# EasyEDA Pro project li-chuang-kai-fa-ban-pid-jian-yi-ru-men-tao-jian-c5ce5a79.epro

# Schematic Schematic1
Board Name: V1.0.0; Create Date: 2025-01-16; Page Name: P1; Project Name: PID简易入门套件; Schematic Name: Schematic1; Update Date: 2025-02-06; Company: 嘉立创EDA; Page Size: A4; Reviewed: 嘉立创EDA
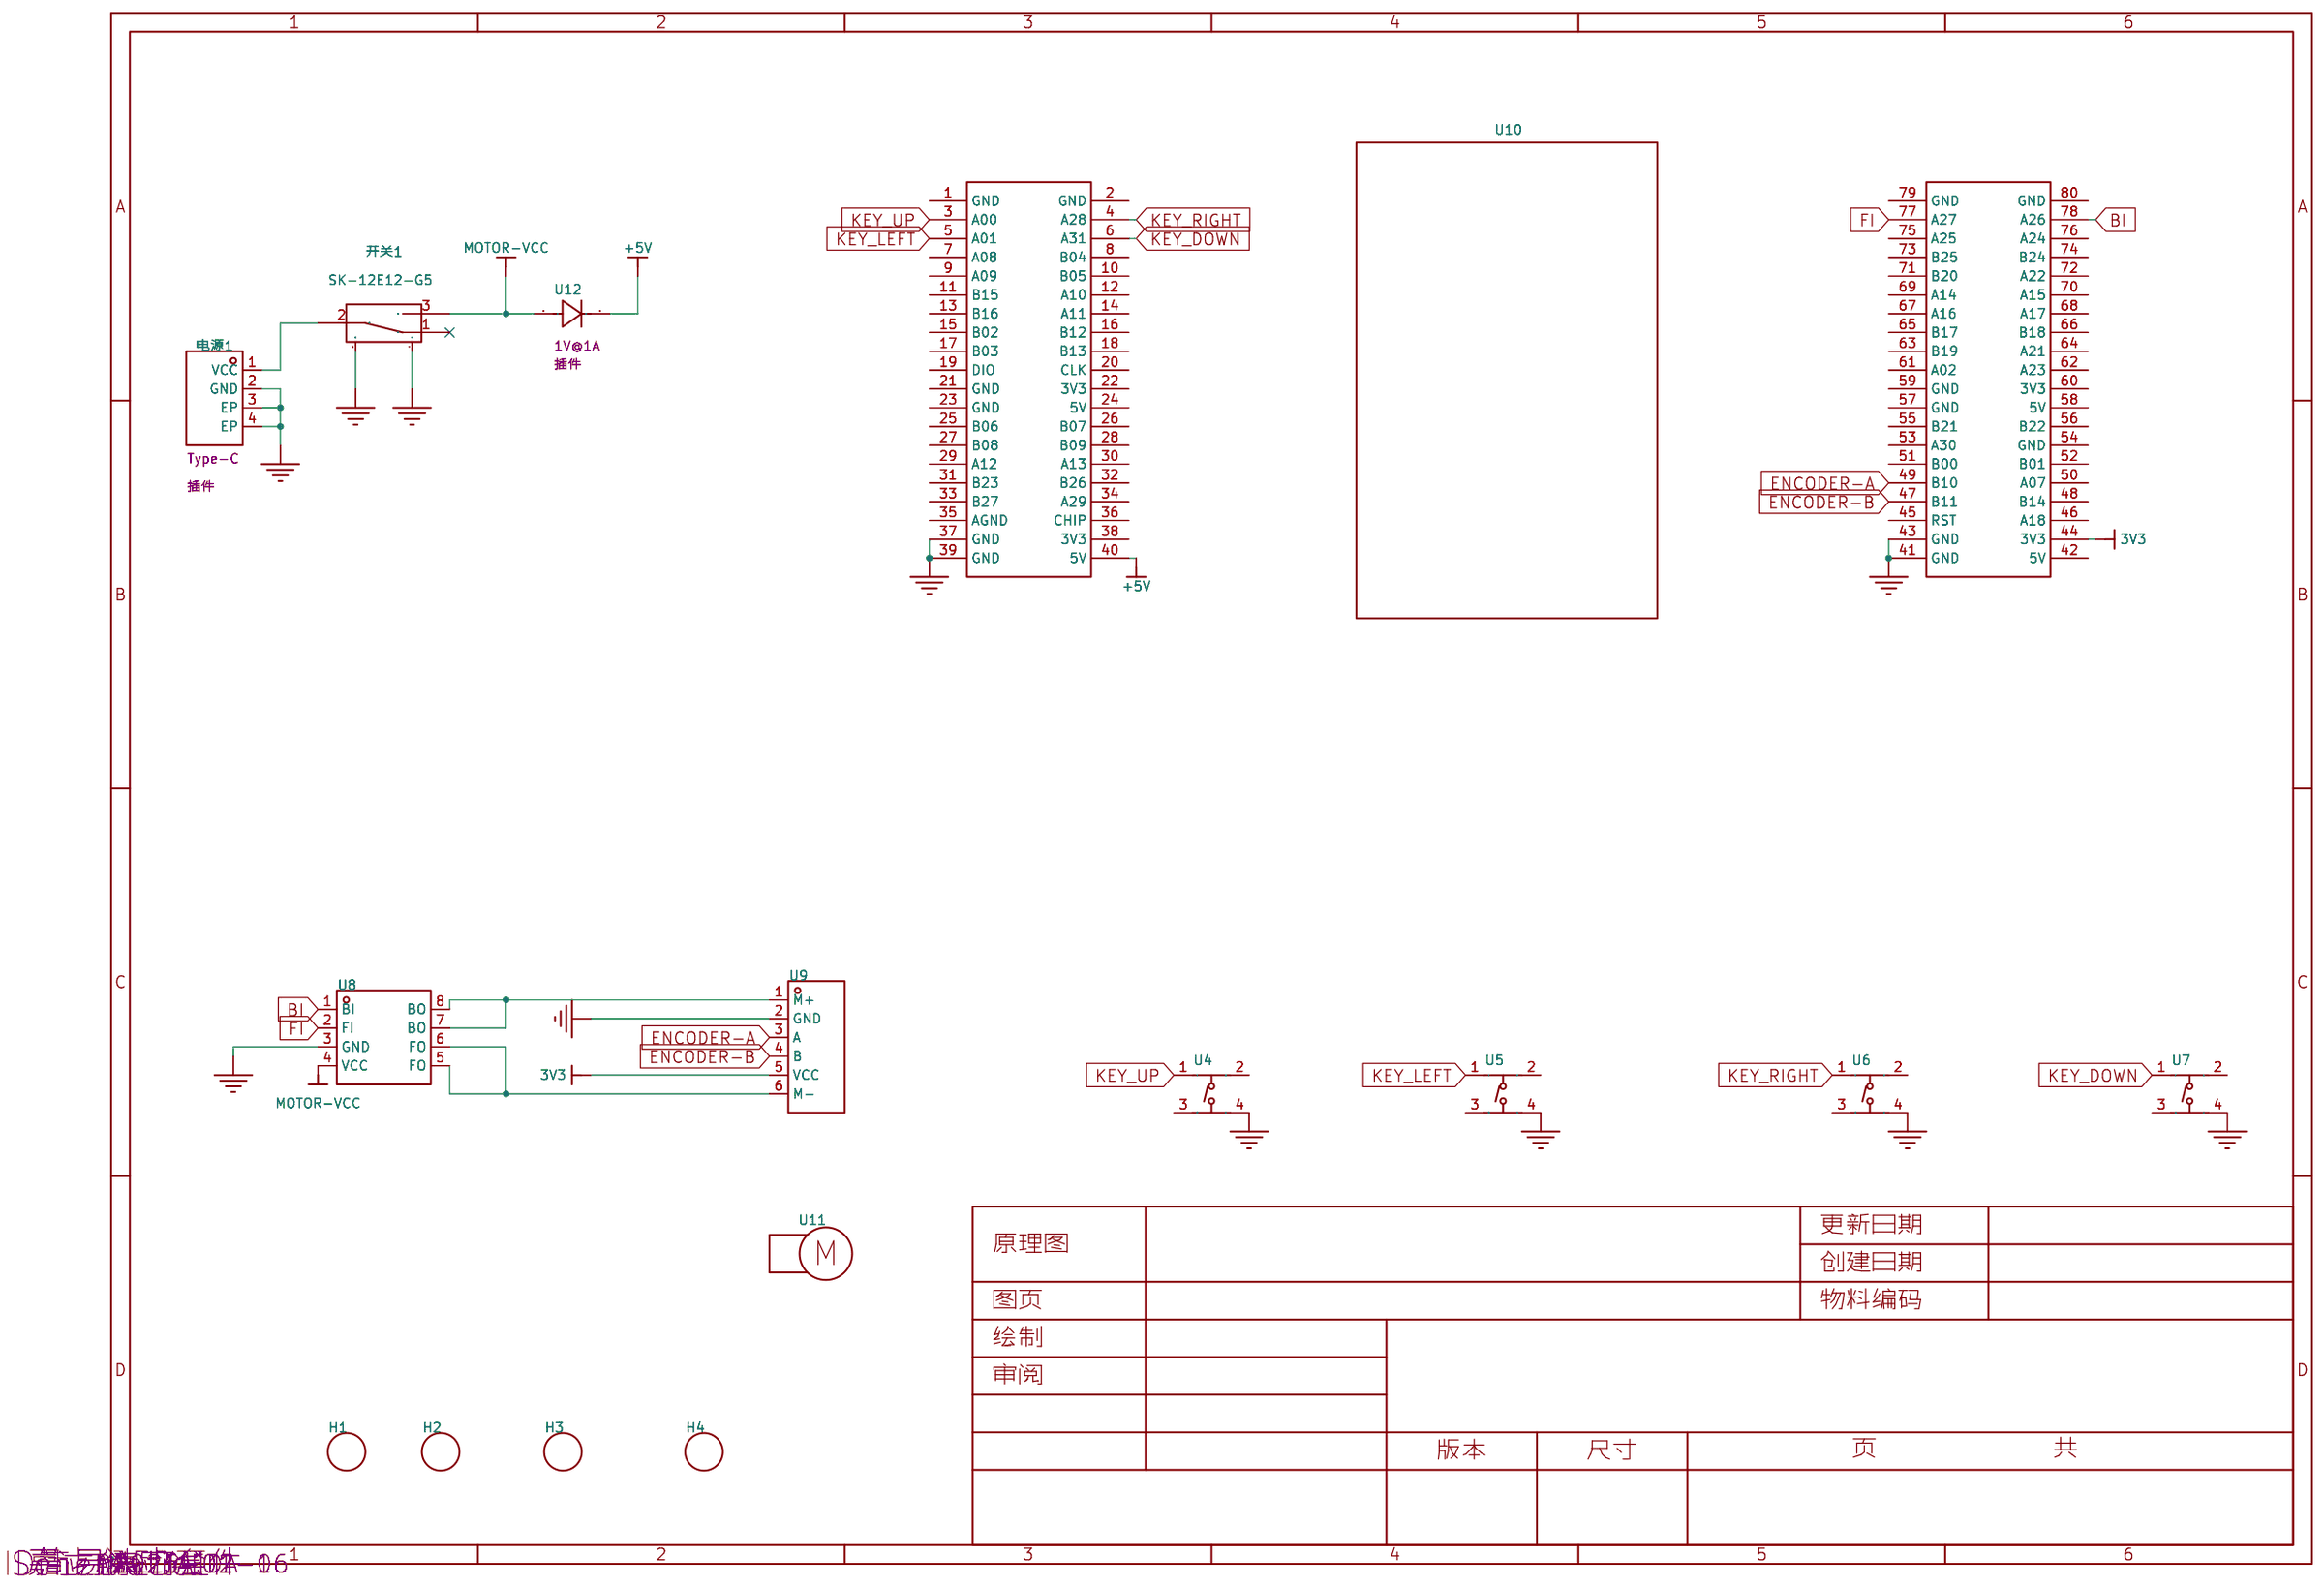
[diagram p0: schematic sheet]

## Parts
H1  M3  [m3 125x300]
H2  M3  [m3 125x300]
H3  M3  [m3 125x300]
H4  M3  [m3 125x300]
U4  ZX-QC66-8.5CJ  [SW-TH_4P-L6.0-W6.0-P4.50-LS6.3]
U5  ZX-QC66-8.5CJ  [SW-TH_4P-L6.0-W6.0-P4.50-LS6.3]
U6  ZX-QC66-8.5CJ  [SW-TH_4P-L6.0-W6.0-P4.50-LS6.3]
U7  ZX-QC66-8.5CJ  [SW-TH_4P-L6.0-W6.0-P4.50-LS6.3]
U8  BDR6126D  [DIP-8_L9.3-W6.4-P2.54-LS7.6-BL-1]
U9  2.54mm-6P ZZ  [CONN-TH_6P-P2.50_HCTL_XH-6A_C2908604]
U10  LCKFB-TMX-MSPM0G3507  [COMM-TH_LCKFB-TMX-MSPM0G3507]
U11  -  [TT马达]
U12  D7G-T  [DIO-TH_BD2.4-L3.2-P7.20-D0.8-RD]
开关1  SK-12E12-G5  [SW-TH_SK-12E12-G5]
电源1  KH-TYPE-C-2P  [USB-SMD_KH-TYPE-C-2P]

## Library data of the parts
H1-H4 = M3
U4-U7 = ZX-QC66-8.5CJ: 电路结构:单刀单掷;按钮形状:圆形按钮;作用力:2.6N;安装方式:直插;开关长度:6mm;开关宽度:6mm;开关高度:8.5mm;带支架:不带;触点电流:50mA;额定电压(AC):250V;额定电压(DC):12V;绝缘电阻:100MΩ;机械寿命:10万次;; LCSC Part Name: 6*6*8.5插件; Supplier Part: C7470133; Manufacturer: Megastar(兆星); Supplier Footprint: 插件; JLCPCB Part Class: 扩展库; Datasheet: https://atta.szlcsc.com/upload/public/pdf/source/20230724/D2816B8FE4BFA624BB09D744C6224BA3.pdf; Supplier: LCSC; Circuit: 单刀单掷; Actuator Style: 圆形按钮; Operating Force: 2.6N; Mounting Style: 直插; Switch Length: 6mm; Switch Width: 6mm; Switch Height: 8.5mm; Strike Gundam: 不带; Contact Current: 50mA; Voltage Rating (AC): 250V; Voltage Rating (DC): 12V; Insulation Resistance: 100MΩ; Actuator/Cap Color: 黑色; Pin Style: PC引脚; Mechanical Life: 10万次; Operating Temperature: -30℃~+80℃
U8 = BDR6126D: 是一款大功率直流电机驱动芯片，适用智能锁具类、个人护理类和小家电类等产品领域。; Supplier Part: C7424658; Manufacturer: 巴丁微; Supplier Footprint: DIP8; JLCPCB Part Class: Extended Part; Datasheet: https://atta.szlcsc.com/upload/public/pdf/source/20230607/2BC2EC852FA3B6DDCD4BF818ED25DD65.pdf; Supplier: LCSC
U9 = 2.54mm-6P ZZ: 插针结构:1x6P;间距:2.54mm;安装方式:直插;参考系列:XH;总PIN数:6P;排数:1;每排PIN数:6;行距:2.54mm;额定电流:3A;触头材质:黄铜;触头镀层:锡;工作温度范围:-25℃~+85℃;; LCSC Part Name: 1x6P 间距:2.54mm 直插 系列:XH; Supplier Part: C5368779; Manufacturer: SHOU HAN(首韩); Supplier Footprint: 插件,P=2.5mm; JLCPCB Part Class: 扩展库; Datasheet: https://atta.szlcsc.com/upload/public/pdf/source/20230323/AB69DD7279190E5FE809A9C6B8F2D02A.pdf; Supplier: LCSC; Pins Structure: 1x6P; Pitch: 2.54mm; Mounting Style: 直插; Reference Series: XH; Number of Pins: 6P; Number of Rows: 1; Number of PINs Per Row: 6; Row Spacing: 2.54mm; Current Rating (Max): 3A; Contact Material: 黄铜; Contact Plating: 锡; Operating Temperature Range: -25℃~+85℃
U10 = LCKFB-TMX-MSPM0G3507: LCSC Part Name: 立创·天猛星MSPM0G3507开发板 5件套; Supplier Part: C42378531; Manufacturer: 立创开发板; Datasheet: https://atta.szlcsc.com/upload/public/pdf/source/20241209/800332349277522348D9357AB5109808.pdf; Supplier: LCSC
U11 = 直流有刷电机
U12 = D7G-T: 正向压降(Vf):1V@1A;直流反向耐压(Vr):1kV;; LCSC Part Name: 电压:1kV; Supplier Part: C7435972; Manufacturer: DIODES(美台); Supplier Footprint: 插件; JLCPCB Part Class: Extended Part; Datasheet: https://atta.szlcsc.com/upload/public/pdf/source/20230628/9DD5A4548E706B8FBBF1B3A8A9628716.pdf; Supplier: LCSC; Forward Voltage (Vf@If): 1V@1A; Reverse Voltage (Vr): 1kV
开关1 = SK-12E12-G5: 电路结构:单刀双掷;安装方式:侧插;额定电流(DC):-;额定电压(DC):-;额定电流(AC):-;额定电压(AC):-;机械寿命:5千次;; LCSC Part Name: 卧插双档 滑动开关; Supplier Part: C136720; Manufacturer: 韩国韩荣; Supplier Footprint: 插件; Datasheet: https://atta.szlcsc.com/upload/public/pdf/source/20210810/880D64C2F8CCE477762EFCC00B7B7681.pdf; Supplier: LCSC; Circuit: 单刀双掷; Actuator Style: 矩形柱状; Pin Style: PC引脚; Switch Height: 10.6mm; Mounting Style: 侧插; Mechanical Life: 5千次; Operating Temperature: -25℃~+70℃
电源1 = KH-TYPE-C-2P: 连接器类型:Type-C;标准:-;公母:-;端口数量:-;触点数量:2P;安装方式:-;额定电流 - 电源:-;触头材质:-;触头镀层:-;工作温度范围:-;; LCSC Part Name: Type-C; Supplier Part: C2919656; Manufacturer: kinghelm(金航标); Supplier Footprint: 插件; JLCPCB Part Class: 扩展库; Datasheet: https://atta.szlcsc.com/upload/public/pdf/source/20220707/620587A9E0589B27D96D3CEE595CBC98.pdf; Supplier: LCSC; Connector Type: Type-C; Number of Contacts: 2P

## Nets
3V3: U9.5(VCC) U10.44(3V3)
+5V: U10.40(5V) U12.1(K)
GND: U4.4 U5.4 U6.4 U7.4 U8.3(GND) U9.2(GND) U10.37(GND) U10.39(GND) U10.41(GND) U10.43(GND) 开关1.4 开关1.5 电源1.2(GND) 电源1.3(EP) 电源1.4(EP)
BI: U8.1(BI) U10.78(A26)
ENCODER-A: U9.3(A) U10.49(B10)
ENCODER-B: U9.4(B) U10.47(B11)
FI: U8.2(FI) U10.77(A27)
KEY_DOWN: U7.1 U10.6(A31)
KEY_LEFT: U5.1 U10.5(A01)
KEY_RIGHT: U6.1 U10.4(A28)
KEY_UP: U4.1 U10.3(A00)
MOTOR-VCC: U8.4(VCC) U12.2(A) 开关1.3
$1N706: 开关1.2 电源1.1(VCC)
$1N1740: U8.5(FO) U8.6(FO) U9.6(M-)
$1N1765: U8.7(BO) U8.8(BO) U9.1(M+)

Not connected (* = marked no-connect by the designer): U4 2 3; U5 2 3; U6 2 3; U7 2 3; U10 1(GND) 2(GND) 7(A08) 8(B04) 9(A09) 10(B05) 11(B15) 12(A10) 13(B16) 14(A11) 15(B02) 16(B12) 17(B03) 18(B13) 19(DIO) 20(CLK) 21(GND) 22(3V3) 23(GND) 24(5V) 25(B06) 26(B07) 27(B08) 28(B09) 29(A12) 30(A13) 31(B23) 32(B26) 33(B27) 34(A29) 35(AGND) 36(CHIP) 38(3V3) 42(5V) 45(RST) 46(A18) 48(B14) 50(A07) 51(B00) 52(B01) 53(A30) 54(GND) 55(B21) 56(B22) 57(GND) 58(5V) 59(GND) 60(3V3) 61(A02) 62(A23) 63(B19) 64(A21) 65(B17) 66(B18) 67(A16) 68(A17) 69(A14) 70(A15) 71(B20) 72(A22) 73(B25) 74(B24) 75(A25) 76(A24) 79(GND) 80(GND); 开关1 1*

# Schematic V1.0.1-SCH
Board Name: V1.0.1; Create Date: 2025-03-18; Page Name: P1; Project Name: PID简易入门套件; Schematic Name: V1.0.1-SCH; Update Date: 2025-03-18; Company: 嘉立创EDA; Page Size: A4; Reviewed: 嘉立创EDA
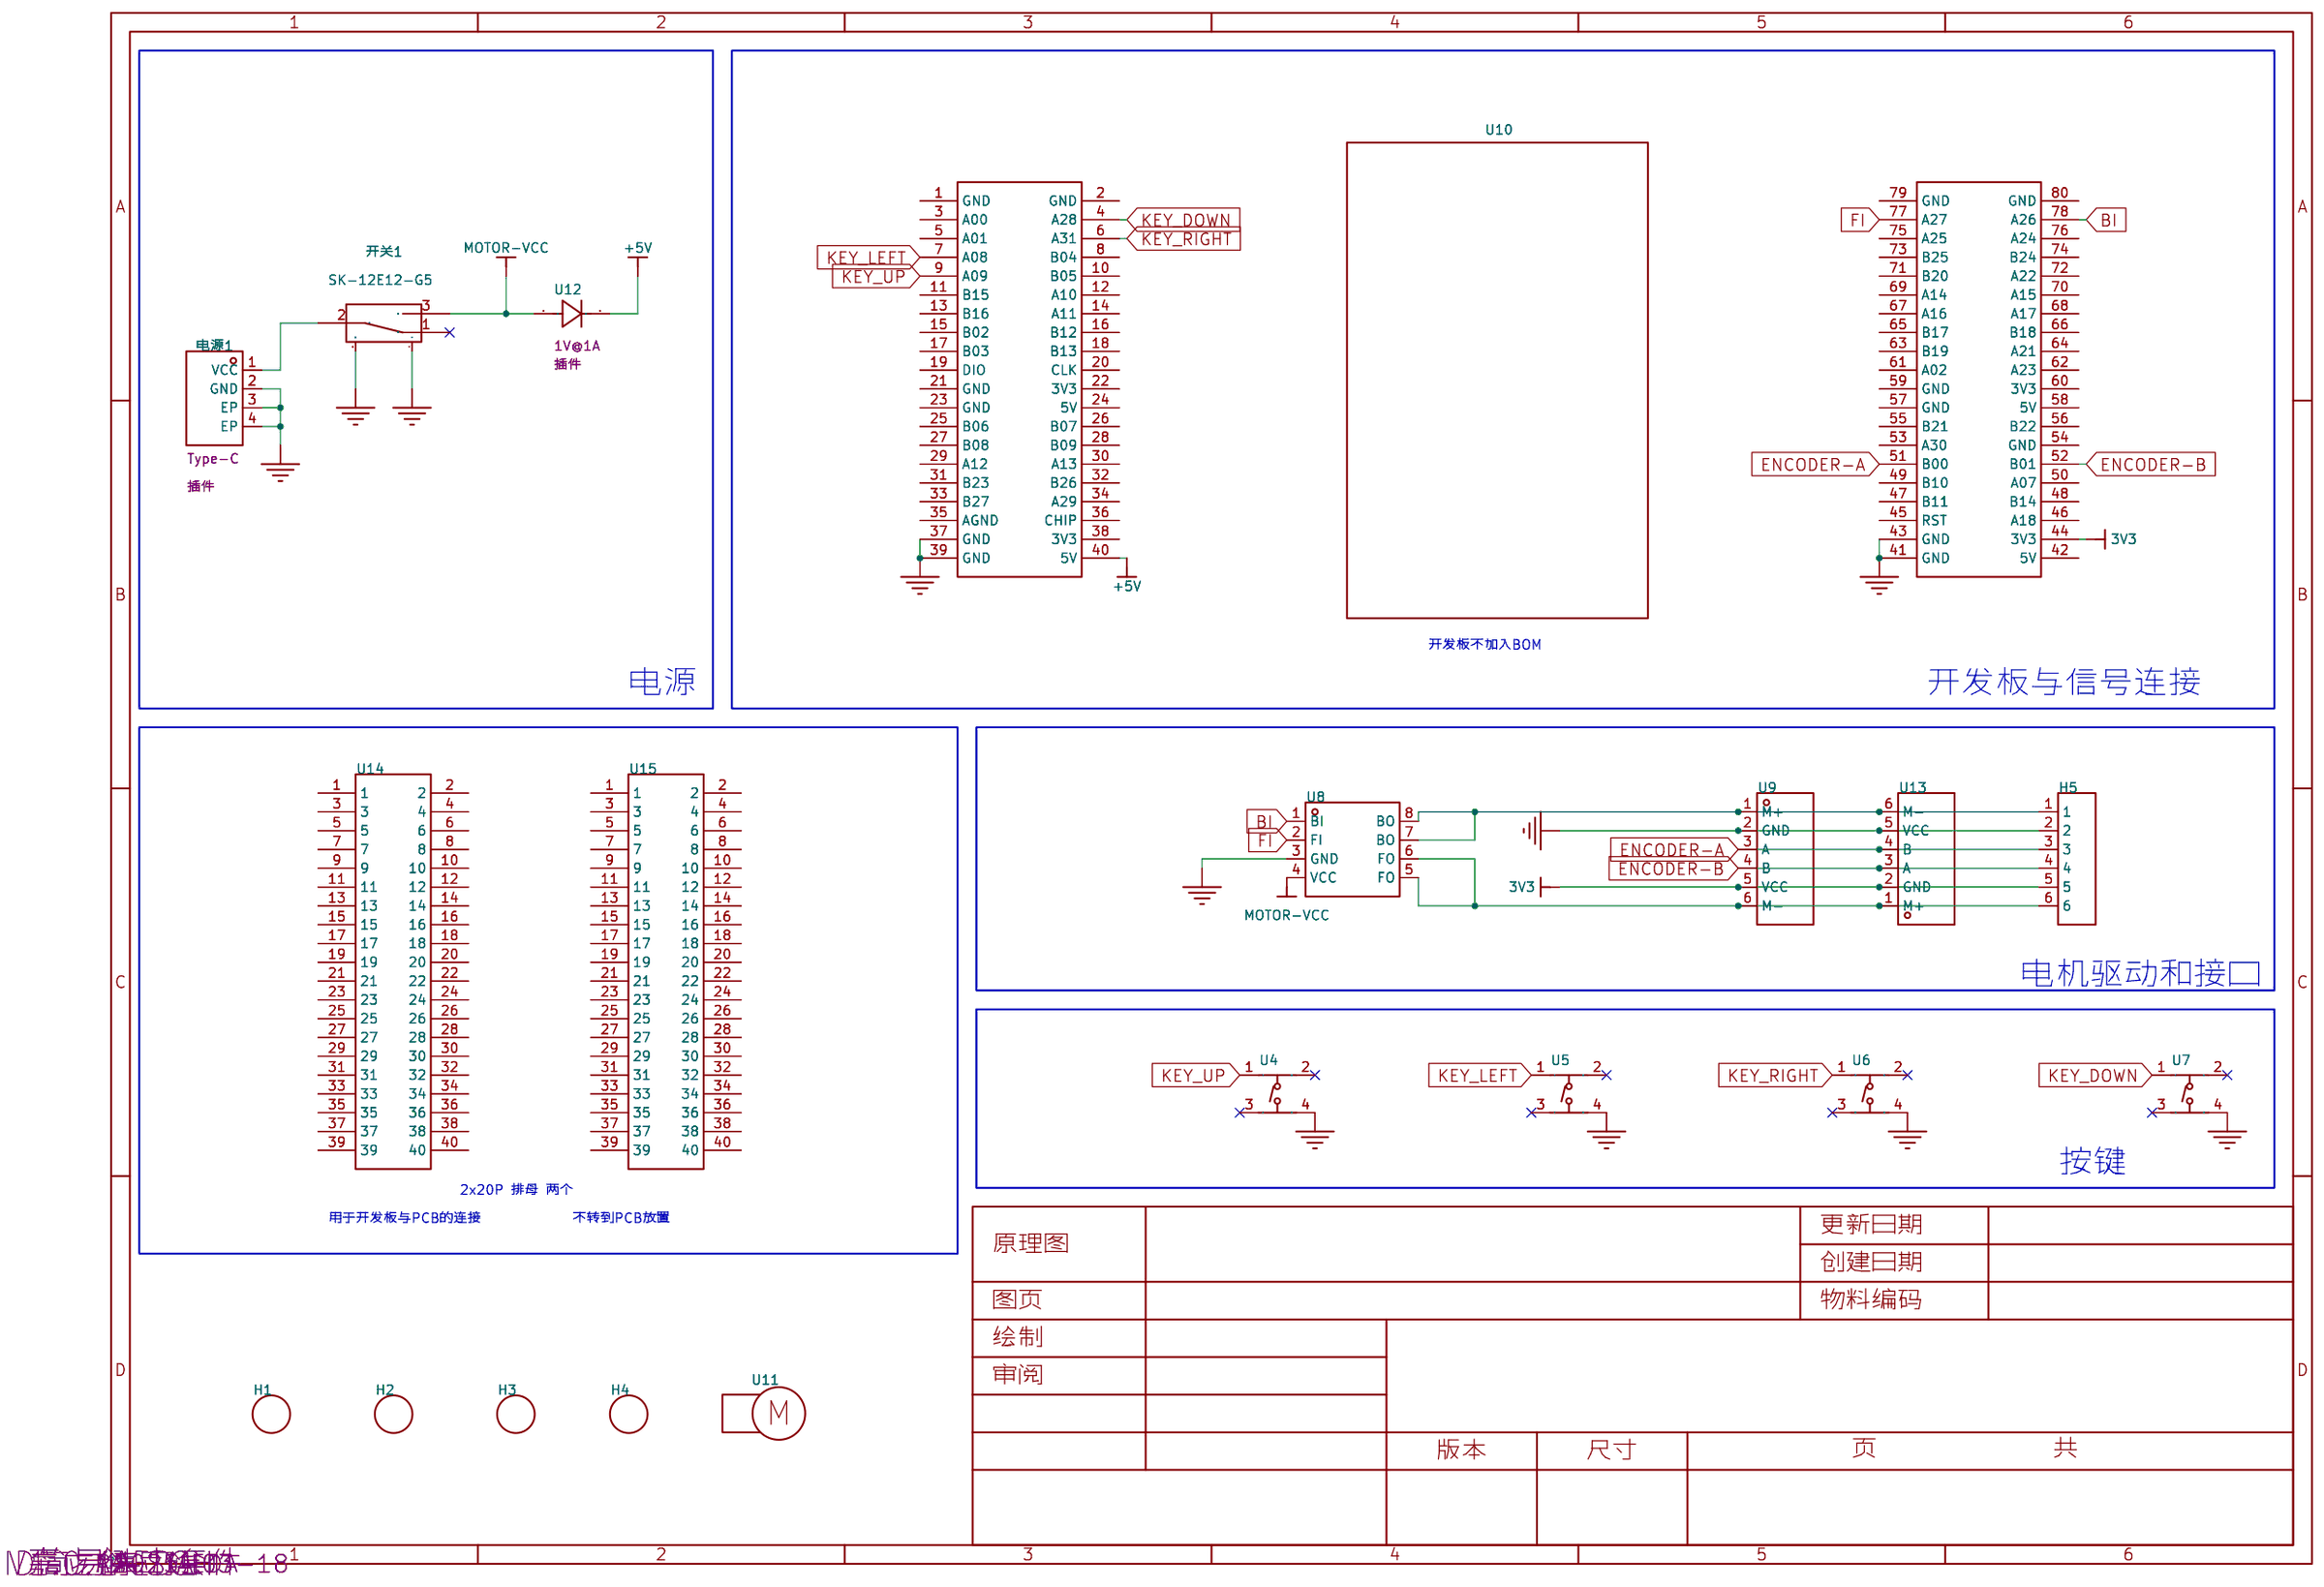
[diagram p1: schematic sheet]

## Parts
H1  M3  [m3 125x300]  (no BOM)
H2  M3  [m3 125x300]  (no BOM)
H3  M3  [m3 125x300]  (no BOM)
H4  M3  [m3 125x300]  (no BOM)
H5  PZ254V-11-06P  [HDR-TH_6P-P2.54-V-M]
U4  ZX-QC66-8.5CJ  [SW-TH_4P-L6.0-W6.0-P4.50-LS6.3]
U5  ZX-QC66-8.5CJ  [SW-TH_4P-L6.0-W6.0-P4.50-LS6.3]
U6  ZX-QC66-8.5CJ  [SW-TH_4P-L6.0-W6.0-P4.50-LS6.3]
U7  ZX-QC66-8.5CJ  [SW-TH_4P-L6.0-W6.0-P4.50-LS6.3]
U8  BDR6126D  [DIP-8_L9.3-W6.4-P2.54-LS7.6-BL-1]
U9  2.54mm-6P ZZ  [CONN-TH_6P-P2.50_HCTL_XH-6A_C2908604]
U10  LCKFB-TMX-MSPM0G3507  [COMM-TH_LCKFB-TMX-MSPM0G3507]  (no BOM)
U11  -  [TT马达]  (no BOM)
U12  D7G-T  [DIO-TH_BD2.4-L3.2-P7.20-D0.8-RD]
U13  2.54mm-6P ZZ  [CONN-TH_6P-P2.50_HCTL_XH-6A_C2908604]
U14  2.54-2*20  [HDR-TH_40P-P2.54-V-F-R2-C20-S2.54]
U15  2.54-2*20  [HDR-TH_40P-P2.54-V-F-R2-C20-S2.54]
开关1  SK-12E12-G5  [SW-TH_SK-12E12-G5]
电源1  KH-TYPE-C-2P  [USB-SMD_KH-TYPE-C-2P]

## Library data of the parts
H1-H4 = M3
H5 = PZ254V-11-06P: 插针结构:1x6P;间距:2.54mm;行距:-;圆针/方针:方针;安装方式:直插;排数:单排;总PIN位数:6P;额定电流:-;额定电压:-;配合针长度:6mm;塑高:2.5mm;端接针长度:3mm;触头材质:黄铜;触头镀层:-;工作温度:-40℃~+105℃;颜色:黑色;; LCSC Part Name: 1x6P 间距:2.54mm 方针 直插; Supplier Part: C492405; Manufacturer: XFCN(兴飞); Supplier Footprint: 插件,P=2.54mm; JLCPCB Part Class: 扩展库; Datasheet: https://atta.szlcsc.com/upload/public/pdf/source/20200309/C492405_597F1930F5B55CC3C7FD95458F1C3977.pdf; Supplier: LCSC; Pin Structure: 1x6P; Pitch: 2.54mm; Circluar Pins/Square Pins: 方针; Mounting Type: 直插; Number of Rows: 单排; Number of Pins: 6P; Length of Mating Pin: 6mm; Insulation Height: 2.5mm; Length of End Connection Pin: 3mm; Contact Material: 黄铜; Operating Temperature: -40℃~+105℃; Color: 黑色
U4-U7 = ZX-QC66-8.5CJ: 电路结构:单刀单掷;按钮形状:圆形按钮;作用力:2.6N;安装方式:直插;开关长度:6mm;开关宽度:6mm;开关高度:8.5mm;带支架:不带;触点电流:50mA;额定电压(AC):250V;额定电压(DC):12V;绝缘电阻:100MΩ;机械寿命:10万次;; LCSC Part Name: 6*6*8.5插件; Supplier Part: C7470133; Manufacturer: Megastar(兆星); Supplier Footprint: 插件; JLCPCB Part Class: 扩展库; Datasheet: https://atta.szlcsc.com/upload/public/pdf/source/20230724/D2816B8FE4BFA624BB09D744C6224BA3.pdf; Supplier: LCSC; Circuit: 单刀单掷; Actuator Style: 圆形按钮; Operating Force: 2.6N; Mounting Style: 直插; Switch Length: 6mm; Switch Width: 6mm; Switch Height: 8.5mm; Strike Gundam: 不带; Contact Current: 50mA; Voltage Rating (AC): 250V; Voltage Rating (DC): 12V; Insulation Resistance: 100MΩ; Actuator/Cap Color: 黑色; Pin Style: PC引脚; Mechanical Life: 10万次; Operating Temperature: -30℃~+80℃
U8 = BDR6126D: 是一款大功率直流电机驱动芯片，适用智能锁具类、个人护理类和小家电类等产品领域。; Supplier Part: C7424658; Manufacturer: 巴丁微; Supplier Footprint: DIP8; JLCPCB Part Class: Extended Part; Datasheet: https://atta.szlcsc.com/upload/public/pdf/source/20230607/2BC2EC852FA3B6DDCD4BF818ED25DD65.pdf; Supplier: LCSC
U9 U13 = 2.54mm-6P ZZ: 插针结构:1x6P;间距:2.54mm;安装方式:直插;参考系列:XH;总PIN数:6P;排数:1;每排PIN数:6;行距:2.54mm;额定电流:3A;触头材质:黄铜;触头镀层:锡;工作温度范围:-25℃~+85℃;; LCSC Part Name: 1x6P 间距:2.54mm 直插 系列:XH; Supplier Part: C5368779; Manufacturer: SHOU HAN(首韩); Supplier Footprint: 插件,P=2.5mm; JLCPCB Part Class: 扩展库; Datasheet: https://atta.szlcsc.com/upload/public/pdf/source/20230323/AB69DD7279190E5FE809A9C6B8F2D02A.pdf; Supplier: LCSC; Pins Structure: 1x6P; Pitch: 2.54mm; Mounting Style: 直插; Reference Series: XH; Number of Pins: 6P; Number of Rows: 1; Number of PINs Per Row: 6; Row Spacing: 2.54mm; Current Rating (Max): 3A; Contact Material: 黄铜; Contact Plating: 锡; Operating Temperature Range: -25℃~+85℃
U10 = LCKFB-TMX-MSPM0G3507: LCSC Part Name: 立创·天猛星MSPM0G3507开发板 5件套; Supplier Part: C42378531; Manufacturer: 立创开发板; Datasheet: https://atta.szlcsc.com/upload/public/pdf/source/20241209/800332349277522348D9357AB5109808.pdf; Supplier: LCSC
U11 = 直流有刷电机
U12 = D7G-T: 正向压降(Vf):1V@1A;直流反向耐压(Vr):1kV;; LCSC Part Name: 电压:1kV; Supplier Part: C7435972; Manufacturer: DIODES(美台); Supplier Footprint: 插件; JLCPCB Part Class: Extended Part; Datasheet: https://atta.szlcsc.com/upload/public/pdf/source/20230628/9DD5A4548E706B8FBBF1B3A8A9628716.pdf; Supplier: LCSC; Forward Voltage (Vf@If): 1V@1A; Reverse Voltage (Vr): 1kV
U14 U15 = 2.54-2*20: 插孔结构:2x20P;间距:2.54mm;行距:2.54mm;圆孔/方孔:方孔;安装类型:直插;排数:双排;总孔位数:40P;额定电流:2.5A;额定电压:-;插孔方向:顶部;塑高:8.5mm;工作温度范围:-40℃~+105℃;; LCSC Part Name: 间距:2.54mm 2x20P 直插; Supplier Part: C2977589; Manufacturer: ZHOURI(洲日); Supplier Footprint: 插件,P=2.54mm; JLCPCB Part Class: 扩展库; Datasheet: https://atta.szlcsc.com/upload/public/pdf/source/20220328/834E302BE3C038BBC5C70F5E02589B1E.pdf; Supplier: LCSC; Holes Structure: 2x20P; Pitch: 2.54mm; Row Spacing: 2.54mm; Circular Hole / Square Hole: 方孔; Mounting Type: 直插; Number of Rows: 双排; Number of Holes: 40P; Current Rating (Max): 2.5A; Holes Direction: 顶部; Insulation Height: 8.5mm; Operating Temperature Range: -40℃~+105℃
开关1 = SK-12E12-G5: 电路结构:单刀双掷;安装方式:侧插;额定电流(DC):-;额定电压(DC):-;额定电流(AC):-;额定电压(AC):-;机械寿命:5千次;; LCSC Part Name: 卧插双档 滑动开关; Supplier Part: C136720; Manufacturer: 韩国韩荣; Supplier Footprint: 插件; Datasheet: https://atta.szlcsc.com/upload/public/pdf/source/20210810/880D64C2F8CCE477762EFCC00B7B7681.pdf; Supplier: LCSC; Circuit: 单刀双掷; Actuator Style: 矩形柱状; Pin Style: PC引脚; Switch Height: 10.6mm; Mounting Style: 侧插; Mechanical Life: 5千次; Operating Temperature: -25℃~+70℃
电源1 = KH-TYPE-C-2P: 连接器类型:Type-C;标准:-;公母:-;端口数量:-;触点数量:2P;安装方式:-;额定电流 - 电源:-;触头材质:-;触头镀层:-;工作温度范围:-;; LCSC Part Name: Type-C; Supplier Part: C2919656; Manufacturer: kinghelm(金航标); Supplier Footprint: 插件; JLCPCB Part Class: 扩展库; Datasheet: https://atta.szlcsc.com/upload/public/pdf/source/20220707/620587A9E0589B27D96D3CEE595CBC98.pdf; Supplier: LCSC; Connector Type: Type-C; Number of Contacts: 2P

## Nets
3V3: H5.5 U9.5(VCC) U10.44(3V3) U13.2(GND)
+5V: U10.40(5V) U12.1(K)
GND: H5.2 U4.4 U5.4 U6.4 U7.4 U8.3(GND) U9.2(GND) U10.37(GND) U10.39(GND) U10.41(GND) U10.43(GND) U13.5(VCC) 开关1.4 开关1.5 电源1.2(GND) 电源1.3(EP) 电源1.4(EP)
BI: U8.1(BI) U10.78(A26)
ENCODER-A: H5.3 U9.3(A) U10.51(B00) U13.4(B)
ENCODER-B: H5.4 U9.4(B) U10.52(B01) U13.3(A)
FI: U8.2(FI) U10.77(A27)
KEY_DOWN: U7.1 U10.4(A28)
KEY_LEFT: U5.1 U10.7(A08)
KEY_RIGHT: U6.1 U10.6(A31)
KEY_UP: U4.1 U10.9(A09)
MOTOR-VCC: U8.4(VCC) U12.2(A) 开关1.3
$1N706: 开关1.2 电源1.1(VCC)
$1N1740: H5.6 U8.5(FO) U8.6(FO) U9.6(M-) U13.1(M+)
$1N1765: H5.1 U8.7(BO) U8.8(BO) U9.1(M+) U13.6(M-)

Not connected (* = marked no-connect by the designer): U4 2* 3*; U5 2* 3*; U6 2* 3*; U7 2* 3*; U10 1(GND) 2(GND) 3(A00) 5(A01) 8(B04) 10(B05) 11(B15) 12(A10) 13(B16) 14(A11) 15(B02) 16(B12) 17(B03) 18(B13) 19(DIO) 20(CLK) 21(GND) 22(3V3) 23(GND) 24(5V) 25(B06) 26(B07) 27(B08) 28(B09) 29(A12) 30(A13) 31(B23) 32(B26) 33(B27) 34(A29) 35(AGND) 36(CHIP) 38(3V3) 42(5V) 45(RST) 46(A18) 47(B11) 48(B14) 49(B10) 50(A07) 53(A30) 54(GND) 55(B21) 56(B22) 57(GND) 58(5V) 59(GND) 60(3V3) 61(A02) 62(A23) 63(B19) 64(A21) 65(B17) 66(B18) 67(A16) 68(A17) 69(A14) 70(A15) 71(B20) 72(A22) 73(B25) 74(B24) 75(A25) 76(A24) 79(GND) 80(GND); U14 1 2 3 4 5 6 7 8 9 10 11 12 13 14 15 16 17 18 19 20 21 22 23 24 25 26 27 28 29 30 31 32 33 34 35 36 37 38 39 40; U15 1 2 3 4 5 6 7 8 9 10 11 12 13 14 15 16 17 18 19 20 21 22 23 24 25 26 27 28 29 30 31 32 33 34 35 36 37 38 39 40; 开关1 1*

## Notes on the sheet
- 开发板不加入BOM
- 电源
- 开发板与信号连接
- 电机驱动和接口
- 按键
- 2x20P 排母 两个
- 用于开发板与PCB的连接
- 不转到PCB放置

# Schematic V1.0.2-SCH
Board Name: V1.0.2; Create Date: 2025-03-26; Page Name: P1; Project Name: 简易PID入门项目; Schematic Name: V1.0.2-SCH; Update Date: 2025-04-11; Company: 嘉立创EDA; Page Size: A4; Reviewed: 立创开发板; Version: V1.0.2
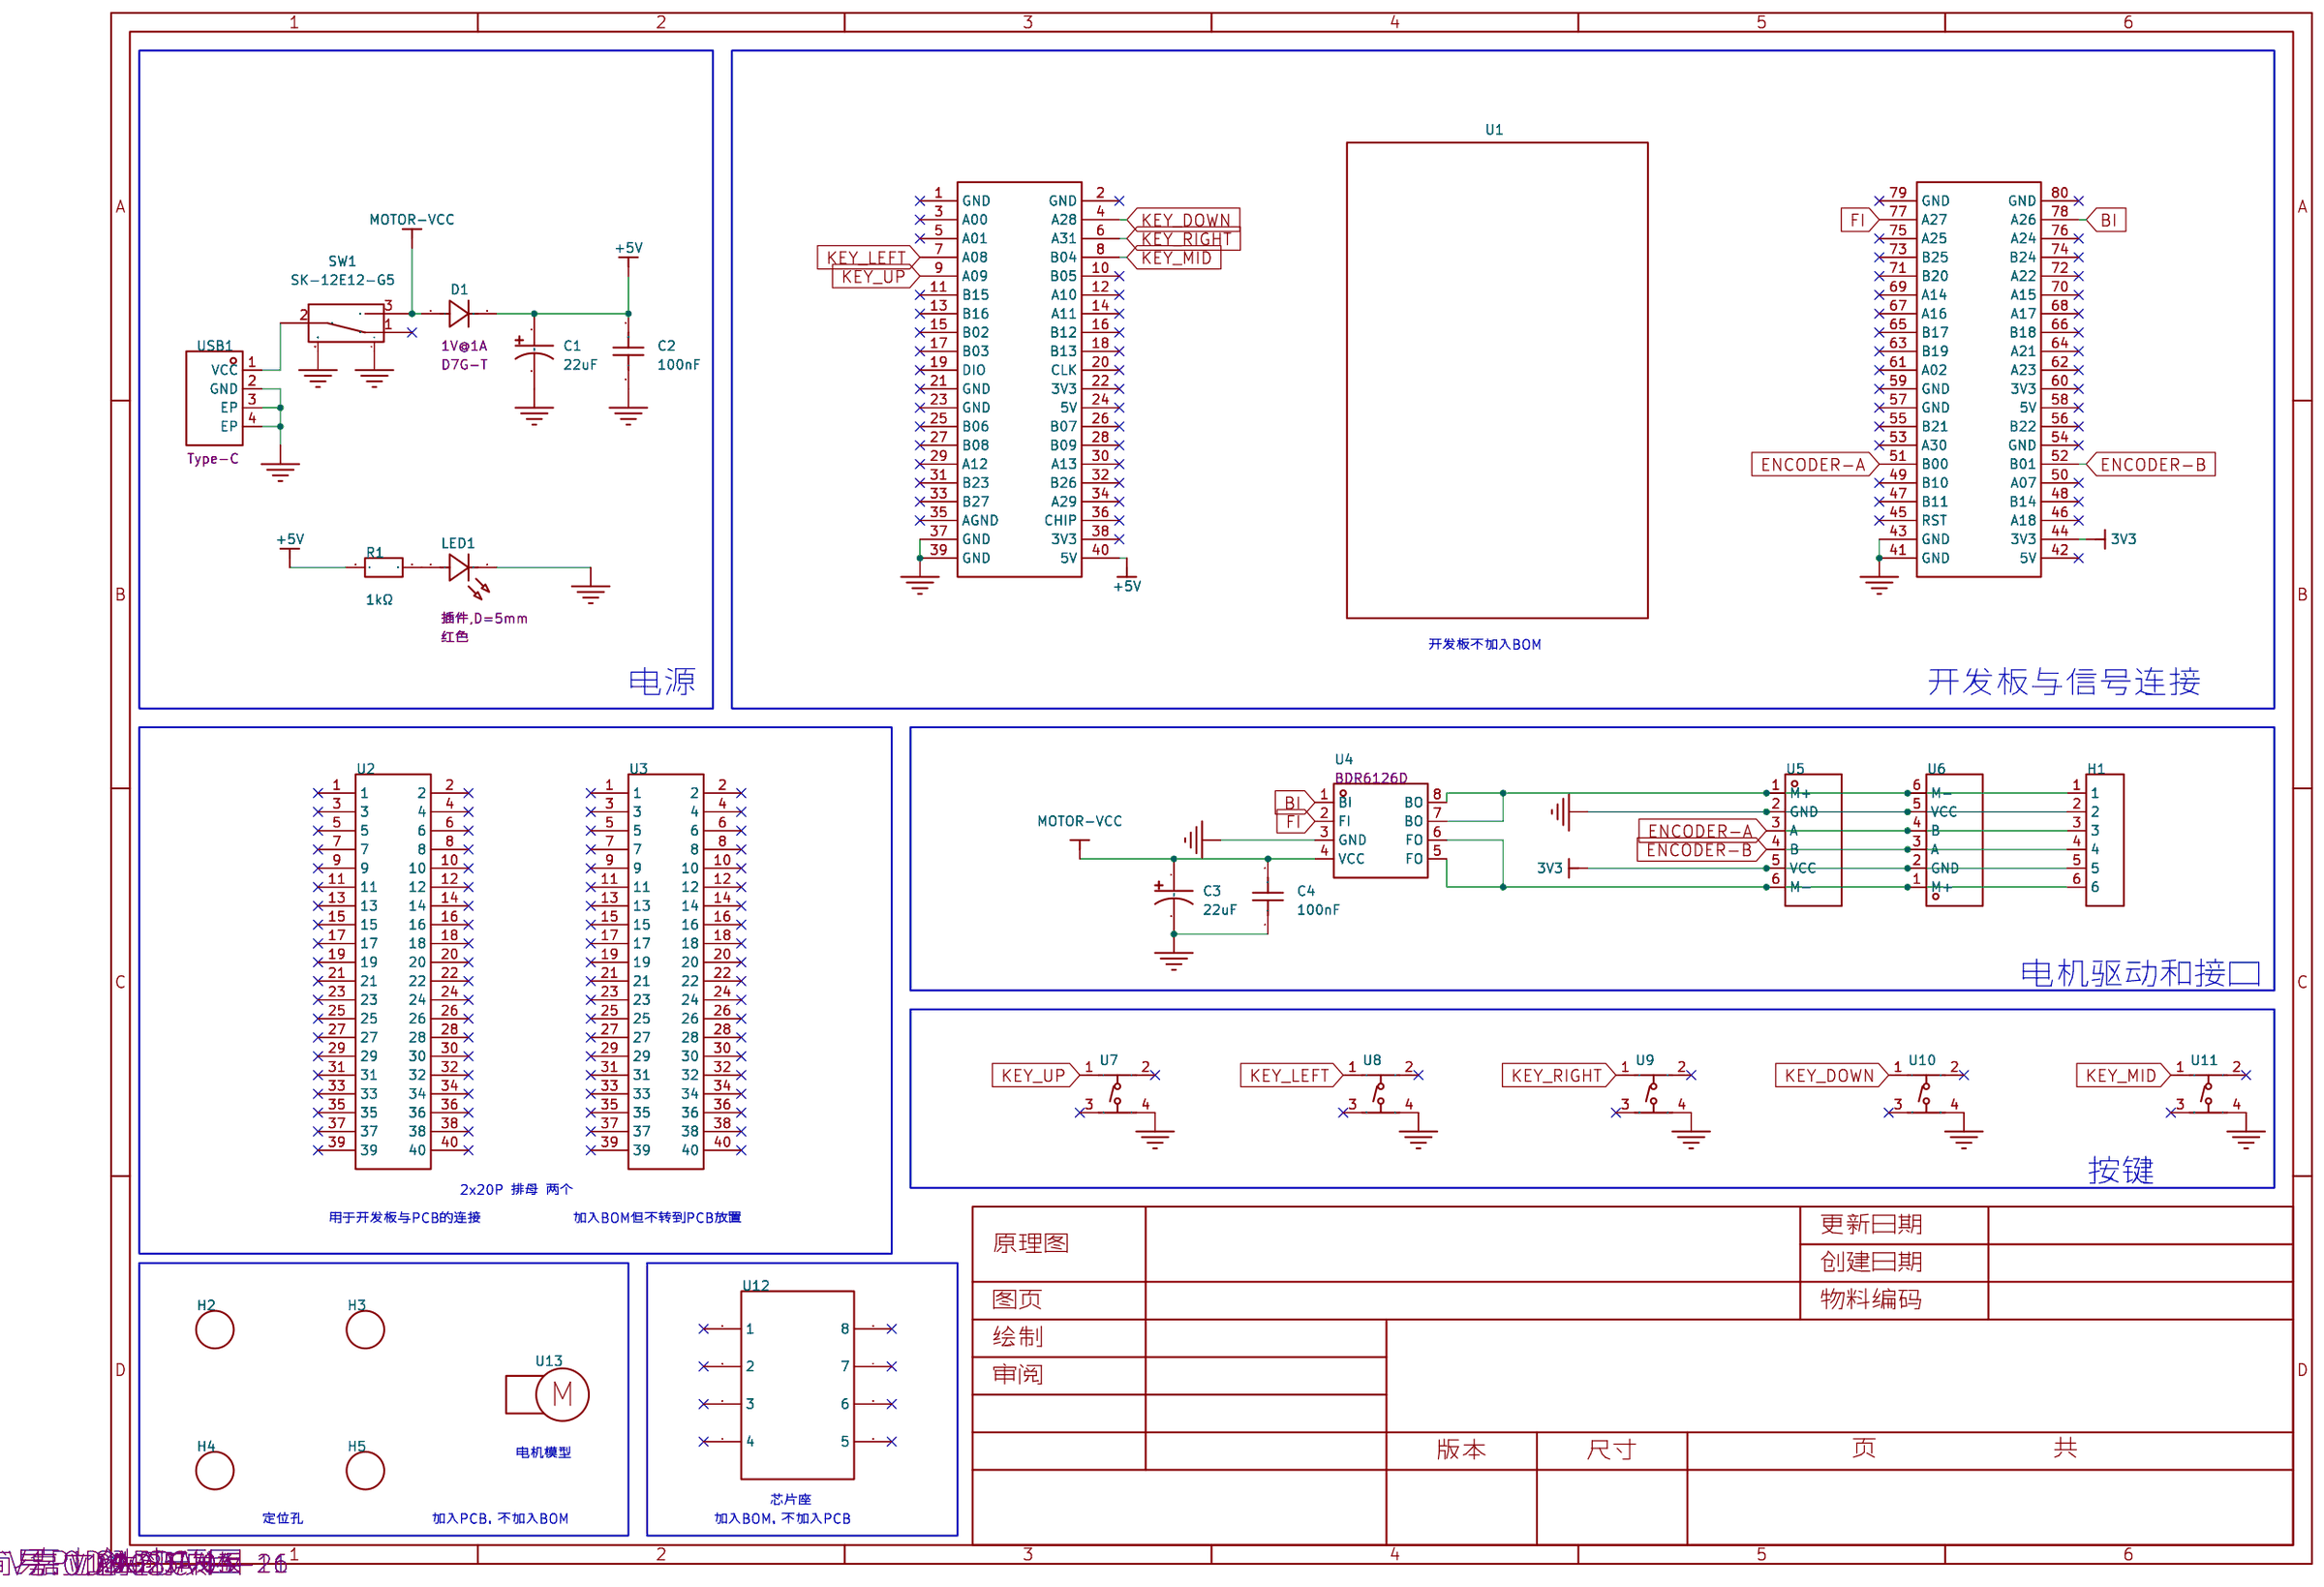
[diagram p2: schematic sheet]

## Parts
C1  22uF  [CAP-TH_BD6.3-P2.50-D1.0-FD]
C2  100nF  [CAP-TH_L5.0-W2.5-P5.00-D1.0]
C3  22uF  [CAP-TH_BD6.3-P2.50-D1.0-FD]
C4  100nF  [CAP-TH_L5.0-W2.5-P5.00-D1.0]
D1  D7G-T  [DIO-TH_BD2.4-L3.2-P7.20-D0.8-RD]
H1  PZ254V-11-06P  [HDR-TH_6P-P2.54-V-M]
H2  M3  [m3 125x300]  (no BOM)
H3  M3  [m3 125x300]  (no BOM)
H4  M3  [m3 125x300]  (no BOM)
H5  M3  [m3 125x300]  (no BOM)
LED1  XL-502SURD  [LED-TH_BD5.9-P2.54-RD_RED]
R1  1kΩ  [RES-TH_BD2.7-L6.2-P10.20-D0.4]
SW1  SK-12E12-G5  [SW-TH_SK-12E12-G5]
U1  LCKFB-TMX-MSPM0G3507  [COMM-TH_LCKFB-TMX-MSPM0G3507]  (no BOM)
U2  2.54-2*20  [HDR-TH_40P-P2.54-V-F-R2-C20-S2.54]
U3  2.54-2*20  [HDR-TH_40P-P2.54-V-F-R2-C20-S2.54]
U4  BDR6126D  [DIP-8_L9.3-W6.4-P2.54-LS7.6-BL-1]
U5  2.54mm-6P ZZ  [CONN-TH_6P-P2.50_HCTL_XH-6A_C2908604]
U6  2.54mm-6P ZZ  [CONN-TH_6P-P2.50_HCTL_XH-6A_C2908604]
U7  ZX-QC66-8.5CJ  [SW-TH_4P-L6.0-W6.0-P4.50-LS6.3]
U8  ZX-QC66-8.5CJ  [SW-TH_4P-L6.0-W6.0-P4.50-LS6.3]
U9  ZX-QC66-8.5CJ  [SW-TH_4P-L6.0-W6.0-P4.50-LS6.3]
U10  ZX-QC66-8.5CJ  [SW-TH_4P-L6.0-W6.0-P4.50-LS6.3]
U11  ZX-QC66-8.5CJ  [SW-TH_4P-L6.0-W6.0-P4.50-LS6.3]
U12  DS1009-08AT1NX-0A2  [DIP-8_L10.2-W10.2-P2.54-LS7.6-BL]
U13  -  [TT马达]  (no BOM)
USB1  KH-TYPE-C-2P  [USB-SMD_KH-TYPE-C-2P]

## Library data of the parts
C1 C3 = 100YXJ22M6.3X11: 容值:22uF;精度:±20%;额定电压:100V;纹波电流:267mA@100kHz;等效串联电阻:-;; LCSC Part Name: 22uF ±20% 100V; Supplier Part: C437651; Manufacturer: rubycon(红宝石); Supplier Footprint: 插件,D6.3xL11mm; JLCPCB Part Class: 扩展库; Datasheet: https://atta.szlcsc.com/upload/public/pdf/source/20191017/237F8CD5A6904EBDB04BEDF106DA4C2A_DBB9D079CC89C336B9F4B5FF0494CD9C.pdf; Supplier: LCSC; Tolerance: ±20%; Rated Voltage: 100V; Ripple Current: 267mA@100kHz; Lead Spacing: 2.5mm; φD: 6.3mm; L: 11mm; Lifetime @ Temp: 7000hrs@105℃; Operating Temperature: -40℃~+105℃
C2 C4 = CC1H104MC1FD3F6C10MF: 容值:100nF;精度:±20%;额定电压:50V;温度系数:Y5V;; LCSC Part Name: 100nF ±20% 50V; Supplier Part: C254085; Manufacturer: Dersonic(德尔创); Supplier Footprint: 插件,P=5.08mm; JLCPCB Part Class: 扩展库; Datasheet: https://atta.szlcsc.com/upload/public/pdf/source/20200826/C254085_159DD65BF32BF11C9168D341BCE23E6F.pdf; Supplier: LCSC; Tolerance: ±20%; Voltage Rating: 50V; Pin Spacing: 5.08mm; Temperature Coefficient: Y5V; Diameter: 6mm; Body Thickness: 2.2mm; Capacitance: 104
D1 = D7G-T: 正向压降(Vf):1V@1A;直流反向耐压(Vr):1kV;; LCSC Part Name: 电压:1kV; Supplier Part: C7435972; Manufacturer: DIODES(美台); Supplier Footprint: 插件; JLCPCB Part Class: Extended Part; Datasheet: https://atta.szlcsc.com/upload/public/pdf/source/20230628/9DD5A4548E706B8FBBF1B3A8A9628716.pdf; Supplier: LCSC; Forward Voltage (Vf@If): 1V@1A; Reverse Voltage (Vr): 1kV
H1 = PZ254V-11-06P: 插针结构:1x6P;间距:2.54mm;行距:-;圆针/方针:方针;安装方式:直插;排数:单排;总PIN位数:6P;额定电流:-;额定电压:-;配合针长度:6mm;塑高:2.5mm;端接针长度:3mm;触头材质:黄铜;触头镀层:-;工作温度:-40℃~+105℃;颜色:黑色;; LCSC Part Name: 1x6P 间距:2.54mm 方针 直插; Supplier Part: C492405; Manufacturer: XFCN(兴飞); Supplier Footprint: 插件,P=2.54mm; JLCPCB Part Class: 扩展库; Datasheet: https://atta.szlcsc.com/upload/public/pdf/source/20200309/C492405_597F1930F5B55CC3C7FD95458F1C3977.pdf; Supplier: LCSC; Pin Structure: 1x6P; Pitch: 2.54mm; Circluar Pins/Square Pins: 方针; Mounting Type: 直插; Number of Rows: 单排; Number of Pins: 6P; Length of Mating Pin: 6mm; Insulation Height: 2.5mm; Length of End Connection Pin: 3mm; Contact Material: 黄铜; Operating Temperature: -40℃~+105℃; Color: 黑色
H2-H5 = M3
LED1 = XL-502SURD: 灯头类型:5mm圆形灯头;发光颜色:红色;正向电压(VF):2.4V;功率:80mW;正向电流:20mA;主波长:-;透镜颜色:红色透镜;色温:-;发光强度:300mcd;发光角度:35°;载带方式:-;工作温度:-25℃~+85℃;; Supplier Part: C2895492; Manufacturer: XINGLIGHT(成兴光); Supplier Footprint: 插件,D=5mm; JLCPCB Part Class: 扩展库; Datasheet: https://atta.szlcsc.com/upload/public/pdf/source/20220816/7D3B6C5DAA6D3D612C28AF3454ED9DF8.pdf; Supplier: LCSC; Lamp Holder Type: 5mm圆形灯头; Emitted Color: 红色; Forward Voltage (VF): 2.4V; Power Dissipation: 80mW; Forward Current: 20mA; Peak Wavelength: 654nm; Lens Color: 红色透镜; Luminous Intensity: 300mcd; Viewing Angle: 35°; Operating Temperature: -25℃~+85℃
R1 = MF1/4W-1K±1%-ST52: 电阻类型:金属膜电阻;阻值:1kΩ;精度:±1%;功率:250mW;温度系数:±100ppm/℃;; LCSC Part Name: 金属膜电阻 1kΩ ±1% 250mW; Supplier Part: C2903245; Manufacturer: VO(翔胜); Supplier Footprint: 插件,D2.7xL6.2mm; JLCPCB Part Class: 扩展库; Datasheet: https://atta.szlcsc.com/upload/public/pdf/source/20200609/C601728_5AA4C0C8E12E11069DA2C3356F29D1F2.pdf; Supplier: LCSC; Type: 金属膜电阻; Tolerance: ±1%; Overload Voltage (Max): 250V; Power(Watts): 250mW; Temperature Coefficient: ±100ppm/℃; Operating Temperature Range: -55℃~+155℃
SW1 = SK-12E12-G5: 电路结构:单刀双掷;安装方式:侧插;额定电流(DC):-;额定电压(DC):-;额定电流(AC):-;额定电压(AC):-;机械寿命:5千次;; LCSC Part Name: 卧插双档 滑动开关; Supplier Part: C136720; Manufacturer: 韩国韩荣; Supplier Footprint: 插件; Datasheet: https://atta.szlcsc.com/upload/public/pdf/source/20210810/880D64C2F8CCE477762EFCC00B7B7681.pdf; Supplier: LCSC; Circuit: 单刀双掷; Actuator Style: 矩形柱状; Pin Style: PC引脚; Switch Height: 10.6mm; Mounting Style: 侧插; Mechanical Life: 5千次; Operating Temperature: -25℃~+70℃
U1 = LCKFB-TMX-MSPM0G3507: LCSC Part Name: 立创·天猛星MSPM0G3507开发板 5件套; Supplier Part: C42378531; Manufacturer: 立创开发板; Datasheet: https://atta.szlcsc.com/upload/public/pdf/source/20241209/800332349277522348D9357AB5109808.pdf; Supplier: LCSC
U2 U3 = 2.54-2*20: 插孔结构:2x20P;间距:2.54mm;行距:2.54mm;圆孔/方孔:方孔;安装类型:直插;排数:双排;总孔位数:40P;额定电流:2.5A;额定电压:-;插孔方向:顶部;塑高:8.5mm;工作温度范围:-40℃~+105℃;; LCSC Part Name: 间距:2.54mm 2x20P 直插; Supplier Part: C2977589; Manufacturer: ZHOURI(洲日); Supplier Footprint: 插件,P=2.54mm; JLCPCB Part Class: 扩展库; Datasheet: https://atta.szlcsc.com/upload/public/pdf/source/20220328/834E302BE3C038BBC5C70F5E02589B1E.pdf; Supplier: LCSC; Holes Structure: 2x20P; Pitch: 2.54mm; Row Spacing: 2.54mm; Circular Hole / Square Hole: 方孔; Mounting Type: 直插; Number of Rows: 双排; Number of Holes: 40P; Current Rating (Max): 2.5A; Holes Direction: 顶部; Insulation Height: 8.5mm; Operating Temperature Range: -40℃~+105℃
U4 = BDR6126D: 是一款大功率直流电机驱动芯片，适用智能锁具类、个人护理类和小家电类等产品领域。; Supplier Part: C7424658; Manufacturer: 巴丁微; Supplier Footprint: DIP8; JLCPCB Part Class: Extended Part; Datasheet: https://atta.szlcsc.com/upload/public/pdf/source/20230607/2BC2EC852FA3B6DDCD4BF818ED25DD65.pdf; Supplier: LCSC
U5 U6 = 2.54mm-6P ZZ: 插针结构:1x6P;间距:2.54mm;安装方式:直插;参考系列:XH;总PIN数:6P;排数:1;每排PIN数:6;行距:2.54mm;额定电流:3A;触头材质:黄铜;触头镀层:锡;工作温度范围:-25℃~+85℃;; LCSC Part Name: 1x6P 间距:2.54mm 直插 系列:XH; Supplier Part: C5368779; Manufacturer: SHOU HAN(首韩); Supplier Footprint: 插件,P=2.5mm; JLCPCB Part Class: 扩展库; Datasheet: https://atta.szlcsc.com/upload/public/pdf/source/20230323/AB69DD7279190E5FE809A9C6B8F2D02A.pdf; Supplier: LCSC; Pins Structure: 1x6P; Pitch: 2.54mm; Mounting Style: 直插; Reference Series: XH; Number of Pins: 6P; Number of Rows: 1; Number of PINs Per Row: 6; Row Spacing: 2.54mm; Current Rating (Max): 3A; Contact Material: 黄铜; Contact Plating: 锡; Operating Temperature Range: -25℃~+85℃
U7-U11 = ZX-QC66-8.5CJ: 电路结构:单刀单掷;按钮形状:圆形按钮;作用力:2.6N;安装方式:直插;开关长度:6mm;开关宽度:6mm;开关高度:8.5mm;带支架:不带;触点电流:50mA;额定电压(AC):250V;额定电压(DC):12V;绝缘电阻:100MΩ;机械寿命:10万次;; LCSC Part Name: 6*6*8.5插件; Supplier Part: C7470133; Manufacturer: Megastar(兆星); Supplier Footprint: 插件; JLCPCB Part Class: 扩展库; Datasheet: https://atta.szlcsc.com/upload/public/pdf/source/20230724/D2816B8FE4BFA624BB09D744C6224BA3.pdf; Supplier: LCSC; Circuit: 单刀单掷; Actuator Style: 圆形按钮; Operating Force: 2.6N; Mounting Style: 直插; Switch Length: 6mm; Switch Width: 6mm; Switch Height: 8.5mm; Strike Gundam: 不带; Contact Current: 50mA; Voltage Rating (AC): 250V; Voltage Rating (DC): 12V; Insulation Resistance: 100MΩ; Actuator/Cap Color: 黑色; Pin Style: PC引脚; Mechanical Life: 10万次; Operating Temperature: -30℃~+80℃
U12 = DS1009-08AT1NX-0A2: 适用IC封装类型:DIP;间距:2.54mm;行距:7.62mm;总针脚数:8P;触头镀层:锡;; LCSC Part Name: 间距2.54mm P数:8P; Supplier Part: C72124; Manufacturer: CONNFLY; Supplier Footprint: DIP-8; JLCPCB Part Class: 扩展库; Datasheet: https://atta.szlcsc.com/upload/public/pdf/source/20160429/1461922462758.pdf; Supplier: LCSC; IC Type: DIP; Pitch: 2.54mm; Row Spacing: 7.62mm; Number of Positions: 8P; Contact Plating: 锡
U13 = 直流有刷电机
USB1 = KH-TYPE-C-2P: 连接器类型:Type-C;标准:-;公母:-;端口数量:-;触点数量:2P;安装方式:-;额定电流 - 电源:-;触头材质:-;触头镀层:-;工作温度范围:-;; LCSC Part Name: Type-C; Supplier Part: C2919656; Manufacturer: kinghelm(金航标); Supplier Footprint: 插件; JLCPCB Part Class: 扩展库; Datasheet: https://atta.szlcsc.com/upload/public/pdf/source/20220707/620587A9E0589B27D96D3CEE595CBC98.pdf; Supplier: LCSC; Connector Type: Type-C; Number of Contacts: 2P

## Nets
3V3: H1.5 U1.44(3V3) U5.5(VCC) U6.2(GND)
+5V: C1.1 C2.2 D1.1(K) R1.1 U1.40(5V)
GND: C1.2 C2.1 C3.2 C4.1 H1.2 LED1.1(K) SW1.4 SW1.5 U1.37(GND) U1.39(GND) U1.41(GND) U1.43(GND) U4.3(GND) U5.2(GND) U6.5(VCC) U7.4 U8.4 U9.4 U10.4 U11.4 USB1.2(GND) USB1.3(EP) USB1.4(EP)
BI: U1.78(A26) U4.1(BI)
ENCODER-A: H1.3 U1.51(B00) U5.3(A) U6.4(B)
ENCODER-B: H1.4 U1.52(B01) U5.4(B) U6.3(A)
FI: U1.77(A27) U4.2(FI)
KEY_DOWN: U1.4(A28) U10.1
KEY_LEFT: U1.7(A08) U8.1
KEY_MID: U1.8(B04) U11.1
KEY_RIGHT: U1.6(A31) U9.1
KEY_UP: U1.9(A09) U7.1
MOTOR-VCC: C3.1 C4.2 D1.2(A) SW1.3 U4.4(VCC)
$1N706: SW1.2 USB1.1(VCC)
$1N1740: H1.6 U4.5(FO) U4.6(FO) U5.6(M-) U6.1(M+)
$1N1765: H1.1 U4.7(BO) U4.8(BO) U5.1(M+) U6.6(M-)
$1N10337: LED1.2(A) R1.2

Not connected (* = marked no-connect by the designer): SW1 1*; U1 1(GND)* 2(GND)* 3(A00)* 5(A01)* 10(B05)* 11(B15)* 12(A10)* 13(B16)* 14(A11)* 15(B02)* 16(B12)* 17(B03)* 18(B13)* 19(DIO)* 20(CLK)* 21(GND)* 22(3V3)* 23(GND)* 24(5V)* 25(B06)* 26(B07)* 27(B08)* 28(B09)* 29(A12)* 30(A13)* 31(B23)* 32(B26)* 33(B27)* 34(A29)* 35(AGND)* 36(CHIP)* 38(3V3)* 42(5V)* 45(RST)* 46(A18)* 47(B11)* 48(B14)* 49(B10)* 50(A07)* 53(A30)* 54(GND)* 55(B21)* 56(B22)* 57(GND)* 58(5V)* 59(GND)* 60(3V3)* 61(A02)* 62(A23)* 63(B19)* 64(A21)* 65(B17)* 66(B18)* 67(A16)* 68(A17)* 69(A14)* 70(A15)* 71(B20)* 72(A22)* 73(B25)* 74(B24)* 75(A25)* 76(A24)* 79(GND)* 80(GND)*; U2 1* 2* 3* 4* 5* 6* 7* 8* 9* 10* 11* 12* 13* 14* 15* 16* 17* 18* 19* 20* 21* 22* 23* 24* 25* 26* 27* 28* 29* 30* 31* 32* 33* 34* 35* 36* 37* 38* 39* 40*; U3 1* 2* 3* 4* 5* 6* 7* 8* 9* 10* 11* 12* 13* 14* 15* 16* 17* 18* 19* 20* 21* 22* 23* 24* 25* 26* 27* 28* 29* 30* 31* 32* 33* 34* 35* 36* 37* 38* 39* 40*; U7 2* 3*; U8 2* 3*; U9 2* 3*; U10 2* 3*; U11 2* 3*; U12 1* 2* 3* 4* 5* 6* 7* 8*

## Notes on the sheet
- 开发板不加入BOM
- 电源
- 开发板与信号连接
- 电机驱动和接口
- 2x20P 排母 两个
- 按键
- 用于开发板与PCB的连接
- 加入BOM但不转到PCB放置
- 电机模型
- 芯片座
- 定位孔
- 加入PCB，不加入BOM
- 加入BOM，不加入PCB

# Board PCB1
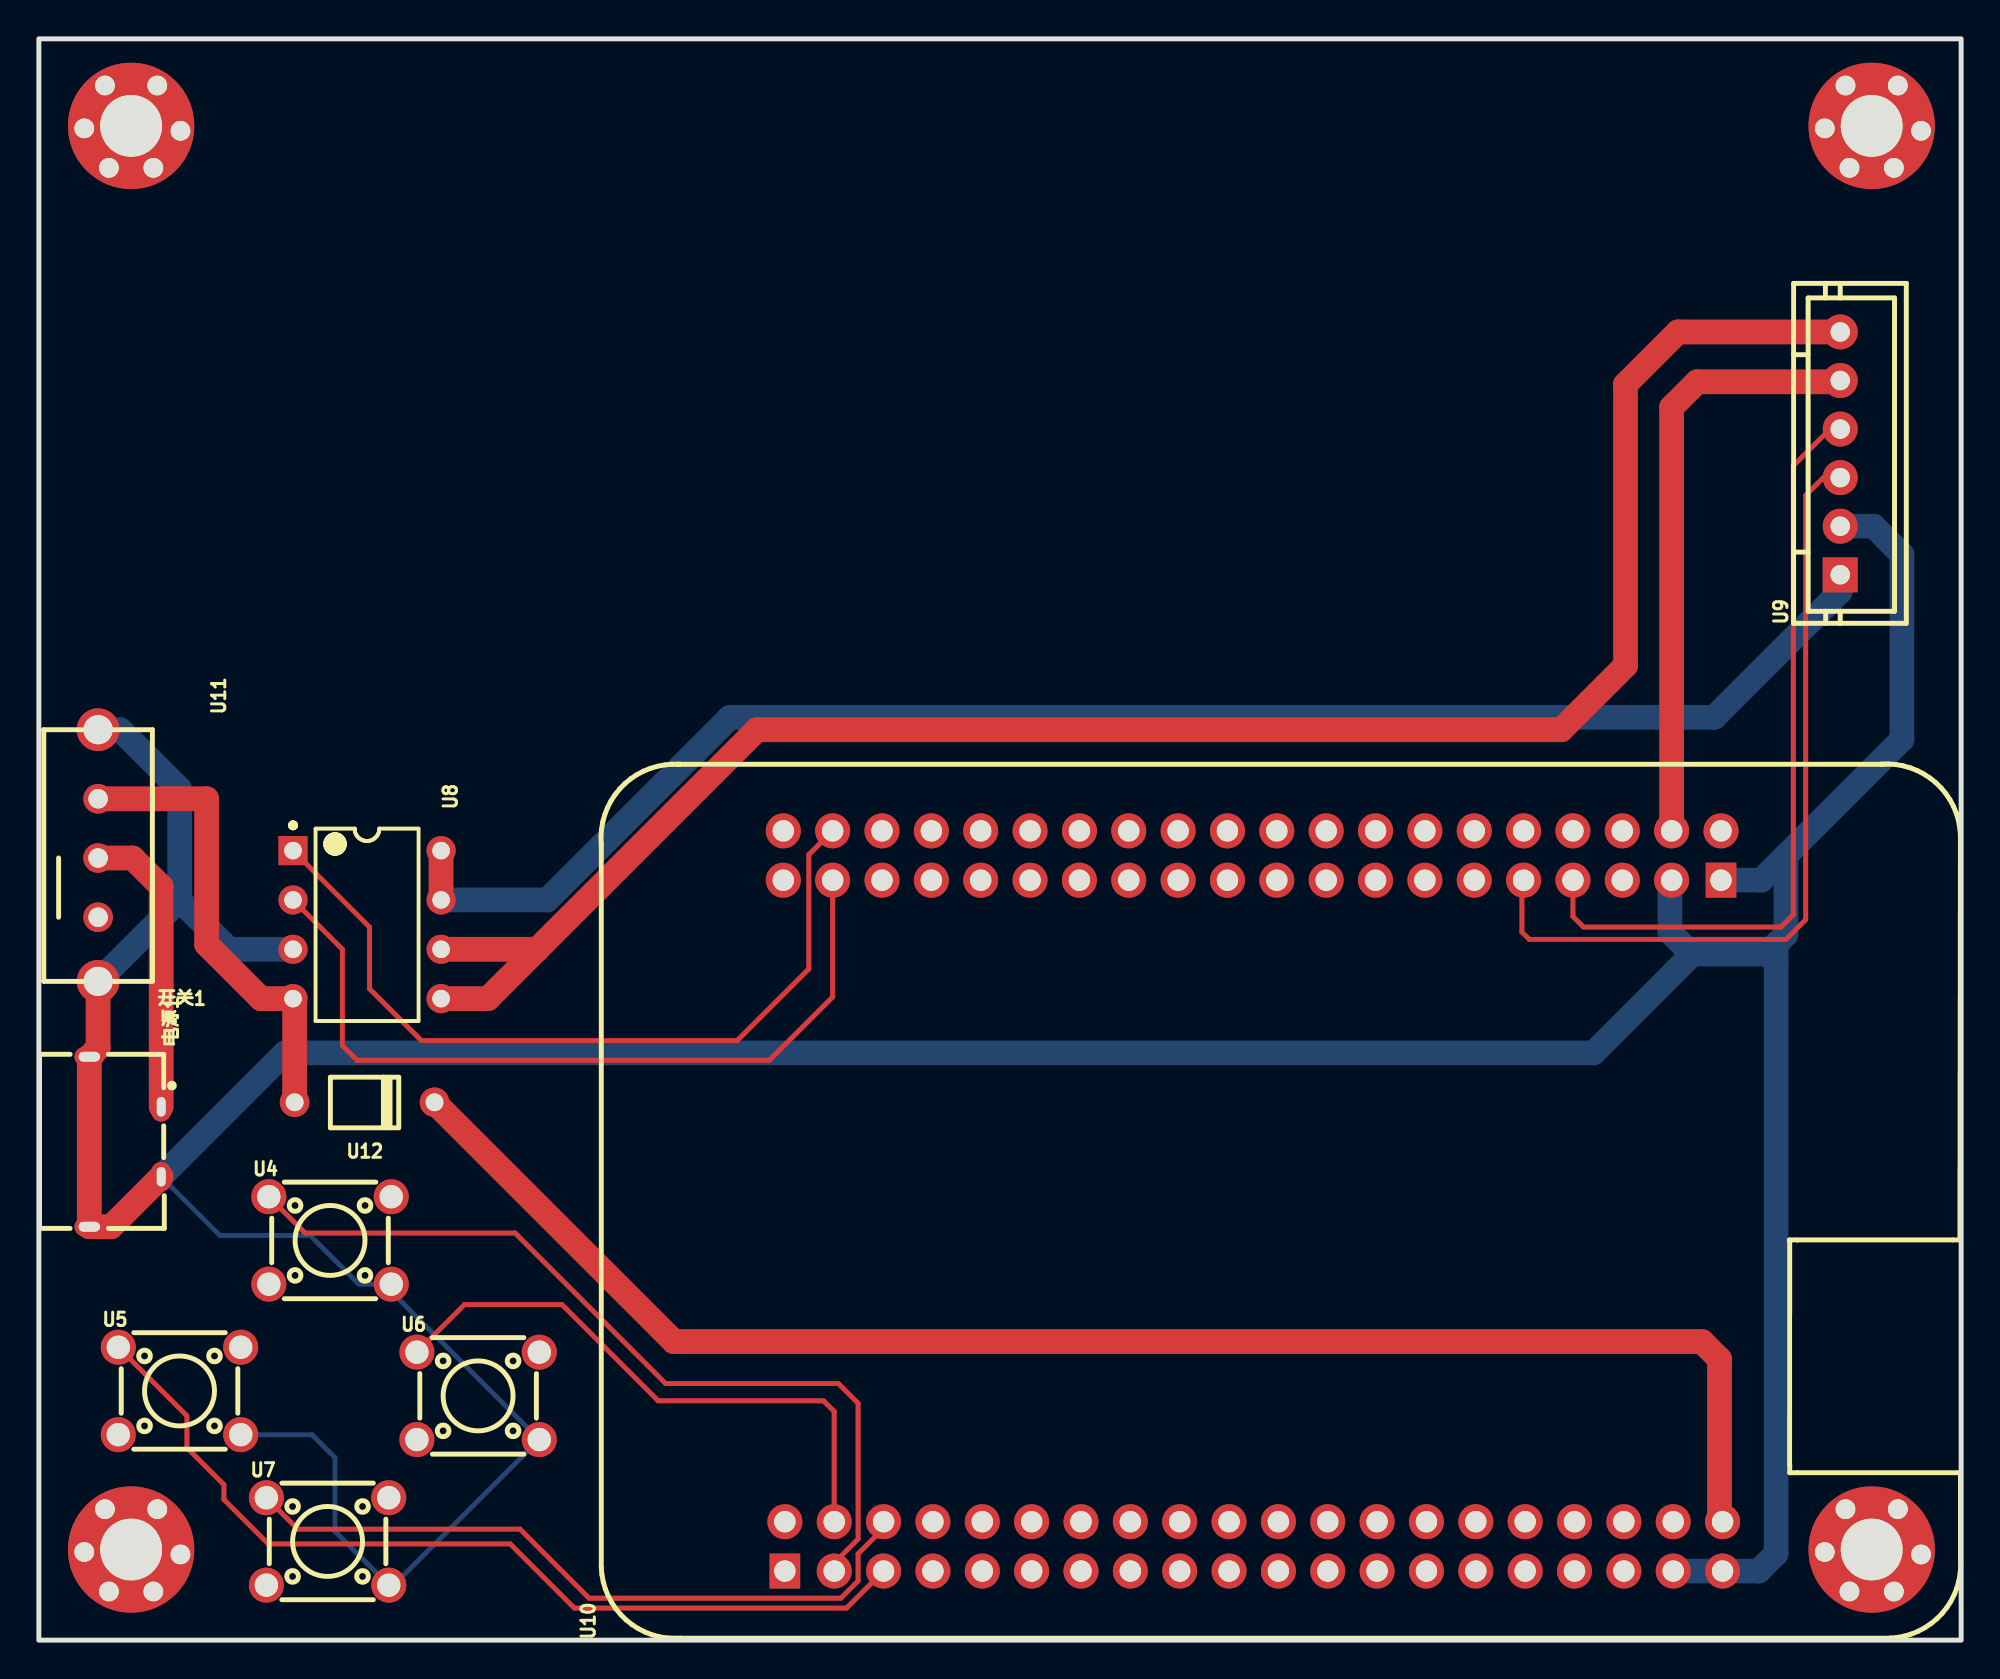
[diagram p3: board, top side]
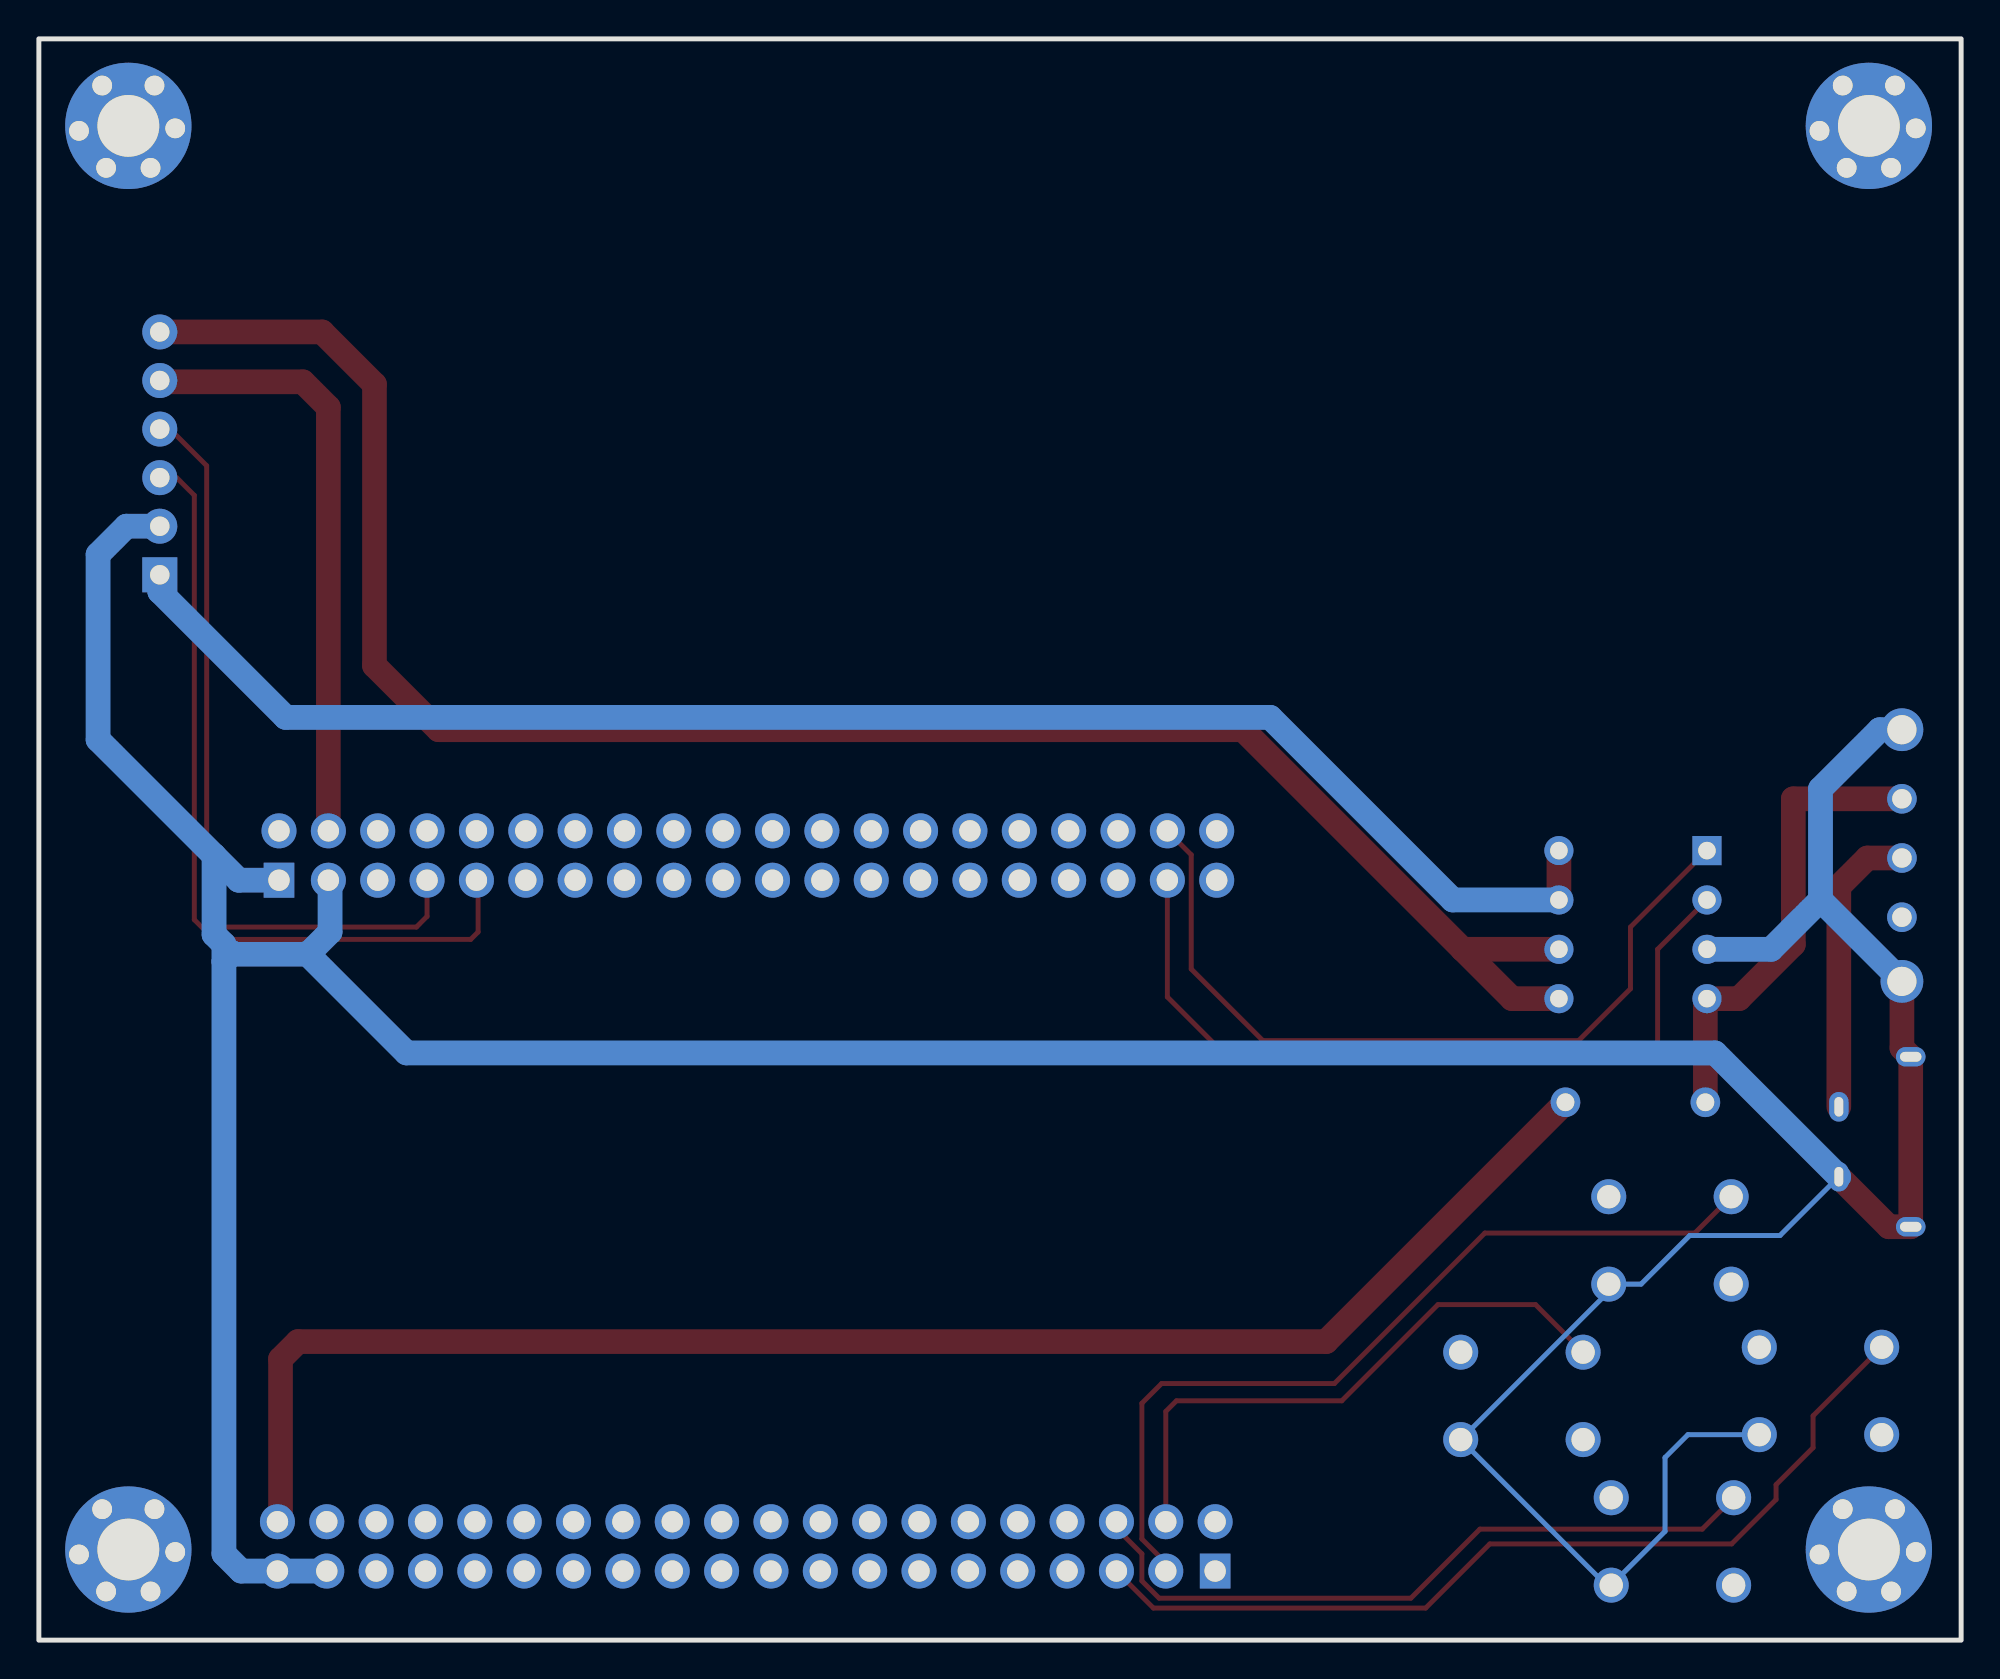
[diagram p4: board, bottom side, seen from below]

Outline 98.93 x 82.42 mm; copper layers: Top Layer, Bottom Layer. Coordinates in mm from the lower left corner of the outline.
Outline path: rectangle 0,82.42 98.93,0
Stack: Top Layer 0.035mm / Dielectric1 1.51mm FR4 er 4.5 / Bottom Layer 0.035mm

## Design rules (mm)
spacing copperThickness1oz (default): track to track 0.102, other pairs 0.152 to 0.3
spacing copperThickness2oz: track to track 0.203, other pairs 0.152 to 0.3
spacing Plane_innerPlane: track to track 0.102, other pairs 0.152 to 0.3
spacing Copper_copperRegion: track to track 0.102, other pairs 0.152 to 0.3
track width copperThickness1oz (default): min 0.127, default 0.254, max 2.54
track width copperThickness2oz: min 0.203, default 0.254, max 2.54
differential pair differentialPair (default): width min 0.127, default 0.254, max 2.54; gap min 0.152, default 0.152

## Placement (name value [footprint] x y rotation side)
H1  M3  [m3 125x300]  4.75 4.66 0 top
H2  M3  [m3 125x300]  4.75 77.94 0 top
H3  M3  [m3 125x300]  94.33 77.94 0 top
H4  M3  [m3 125x300]  94.33 4.66 0 top
U4  ZX-QC66-8.5CJ  [SW-TH_4P-L6.0-W6.0-P4.50-LS6.3]  14.99 20.57 0 top
U5  ZX-QC66-8.5CJ  [SW-TH_4P-L6.0-W6.0-P4.50-LS6.3]  7.24 12.83 0 top
U6  ZX-QC66-8.5CJ  [SW-TH_4P-L6.0-W6.0-P4.50-LS6.3]  22.61 12.57 0 top
U7  ZX-QC66-8.5CJ  [SW-TH_4P-L6.0-W6.0-P4.50-LS6.3]  14.86 5.08 0 top
U8  BDR6126D  [DIP-8_L9.3-W6.4-P2.54-LS7.6-BL-1]  16.89 36.83 270 top
U9  2.54mm-6P ZZ  [CONN-TH_6P-P2.50_HCTL_XH-6A_C2908604]  92.71 61.09 90 top
U10  LCKFB-TMX-MSPM0G3507  [COMM-TH_LCKFB-TMX-MSPM0G3507]  62.48 22.61 90 top
U11  -  [TT马达]  39.5 60.07 90 top
U12  D7G-T  [DIO-TH_BD2.4-L3.2-P7.20-D0.8-RD]  16.76 27.69 180 top
开关1  SK-12E12-G5  [SW-TH_SK-12E12-G5]  3.05 40.39 180 top
电源1  KH-TYPE-C-2P  [USB-SMD_KH-TYPE-C-2P]  4.45 25.65 270 top

## Footprints (pads in the part's own frame, mm; a bottom-side part is the same pattern mirrored in y, then rotated)
COMM-TH_LCKFB-TMX-MSPM0G3507
  rect 1.8x1.575 hole 1.1: 1(-19.05,24.09) 41(16.51,-24.09)
  round 1.8 hole 1.1: 2(-16.51,24.09) 3(-19.05,21.549) 4(-16.51,21.549) 5(-19.05,19.009) 6(-16.51,19.009) 7(-19.05,16.47) 8(-16.51,16.47) 9(-19.05,13.93) 10(-16.51,13.93) 11(-19.05,11.389) 12(-16.51,11.389) 13(-19.05,8.85) 14(-16.51,8.85) 15(-19.05,6.309) 16(-16.51,6.309) 17(-19.05,3.769) 18(-16.51,3.769) 19(-19.05,1.23) 20(-16.51,1.23) 21(-19.05,-1.31) 22(-16.51,-1.31) 23(-19.05,-3.85) 24(-16.51,-3.85) 25(-19.05,-6.391) 26(-16.51,-6.391) 27(-19.05,-8.931) 28(-16.51,-8.931) 29(-19.05,-11.47) 30(-16.51,-11.47) 31(-19.05,-14.011) 32(-16.51,-14.011) 33(-19.05,-16.55) 34(-16.51,-16.55) 35(-19.05,-19.09) 36(-16.51,-19.09) 37(-19.05,-21.631) 38(-16.51,-21.631) 39(-19.05,-24.171) 40(-16.51,-24.171) 42(19.05,-24.09) 43(16.51,-21.549) 44(19.05,-21.549) 45(16.51,-19.009) 46(19.05,-19.009) 47(16.51,-16.47) 48(19.05,-16.47) 49(16.51,-13.93) 50(19.05,-13.93) 51(16.51,-11.389) 52(19.05,-11.389) 53(16.51,-8.85) 54(19.05,-8.85) 55(16.51,-6.309) 56(19.05,-6.309) 57(16.51,-3.769) 58(19.05,-3.769) 59(16.51,-1.23) 60(19.05,-1.23) 61(16.51,1.31) 62(19.05,1.31) 63(16.51,3.85) 64(19.05,3.85) 65(16.51,6.391) 66(19.05,6.391) 67(16.51,8.931) 68(19.05,8.931) 69(16.51,11.47) 70(19.05,11.47) 71(16.51,14.011) 72(19.05,14.011) 73(16.51,16.55) 74(19.05,16.55) 75(16.51,19.09) 76(19.05,19.09) 77(16.51,21.631) 78(19.05,21.631) 79(16.51,24.171) 80(19.05,24.171)
CONN-TH_6P-P2.50_HCTL_XH-6A_C2908604
  rect 1.8x1.8 hole 1: 1(-6.25,0.001)
  round 1.8 hole 1: 2(-3.749,0.001) 3(-1.25,0.001) 4(1.25,0) 5(3.75,-0.001) 6(6.25,-0.001)
DIO-TH_BD2.4-L3.2-P7.20-D0.8-RD
  round 1.524 hole 0.914: 1(-3.6,0) 2(3.6,0)
DIP-8_L9.3-W6.4-P2.54-LS7.6-BL-1
  rect 1.5x1.5 hole 0.9: 1(-3.81,-3.81)
  round 1.5 hole 0.9: 2(-1.27,-3.81) 3(1.27,-3.81) 4(3.81,-3.81) 5(3.81,3.81) 6(1.27,3.81) 7(-1.27,3.81) 8(-3.81,3.81)
m3 125x300
  round 1.016 hole 1.021x1.016: 1(-2.413,-0.127) 1(-1.346,2.078) 1(-1.143,-2.159) 1(1.143,-2.159) 1(1.346,2.078) 1(2.54,-0.254)
  round 6.5 hole 3.18x3.175: 1(0,0)
SW-TH_4P-L6.0-W6.0-P4.50-LS6.3
  round 1.8 hole 1.2: 1(-3.15,2.25) 2(3.15,2.25) 3(-3.15,-2.25) 4(3.15,-2.25)
SW-TH_SK-12E12-G5
  round 1.524 hole 1: 1(0,3.175) 2(0,0.127) 3(0,-2.921)
  round 2.2 hole 1.5: 4(0,-6.477) 5(0,6.477)
USB-SMD_KH-TYPE-C-2P
  oval 1.524x1 hole 1x0.45: 1(-1.8,1.85) 2(1.8,1.85)
  oval 1x1.524 hole 0.5x1.1: 3(4.375,-1.85) 4(-4.375,-1.85)

## Nets
As in the schematic.

Pads without a net: H1 1; H2 1; H3 1; H4 1; U4 2 3; U5 2 3; U6 2 3; U7 2 3; U10 1 2 7 8 9 10 11 12 13 14 15 16 17 18 19 20 21 22 23 24 25 26 27 28 29 30 31 32 33 34 35 36 38 42 45 46 48 50 51 52 53 54 55 56 57 58 59 60 61 62 63 64 65 66 67 68 69 70 71 72 73 74 75 76 79 80; 开关1 1

## Routing (per net, layer and track width the routed paths; a pad name or vN(x,y) marks a point on that pad's centre or on a via; arc(x,y) is an arc through that point)
3V3: length 31.1
  Top Layer w1.27: U9.5 92.64,64.77 85.34,64.77 84.03,63.46 U10.44
+5V: length 80
  Top Layer w1.27: U10.40 86.5,6.25 86.5,14.47 85.6,15.37 32.68,15.37 U12.1
GND: length 250.6
  Top Layer w1.27: 开关1.5 3.05,30.48 电源1.4 电源1.3 3.72,21.28 电源1.2
  Bottom Layer w0.254: U5.4 14.06,10.58 15.24,9.4 15.24,5.6 18.01,2.83 18.26,2.83 U6.4 18.14,17.94 U4.4 16.47,18.32 13.97,20.83 9.32,20.83 电源1.2
  Bottom Layer w1.27: 7.24,38.1 9.78,35.56 U8.3 ; 7.24,38.1 开关1.5 ; 7.24,38.1 7.24,43.81 4.19,46.86 开关1.4 ; 89.41,34.92 89.41,4.44 88.52,3.56 U10.39 U10.37 ; 89.41,34.92 89.41,35.81 89.92,36.32 89.92,40.39 ; 89.41,34.92 88.96,35.37 88.9,35.31 85.09,35.31 ; U10.41 88.65,39.12 89.92,40.39 ; 85.09,35.31 83.95,36.45 83.95,39.03 U10.43 ; 85.09,35.31 80.01,30.23 12.67,30.23 电源1.2 ; 89.92,40.39 95.89,46.35 95.89,55.88 94.43,57.34 U9.2
BI: length 41.6
  Top Layer w0.254: U8.1 17.02,36.7 17.02,33.53 19.69,30.86 35.94,30.86 39.62,34.54 39.62,40.43 U10.78
ENCODER-A: length 41.9
  Top Layer w0.254: U10.49 76.33,39.03 76.33,36.45 76.71,36.07 89.92,36.07 90.93,37.08 90.93,58.93 91.84,59.84 U9.3
ENCODER-B: length 40
  Top Layer w0.254: U9.4 92.18,62.34 90.3,60.45 90.3,37.34 89.66,36.7 79.5,36.7 78.95,37.25 U10.47
FI: length 41.5
  Top Layer w0.254: U10.77 40.85,33.11 37.59,29.84 16.38,29.84 15.62,30.61 15.62,35.56 U8.2
KEY_DOWN: length 36.6
  Top Layer w0.254: U7.1 13.32,5.72 24.77,5.72 28.32,2.16 41.27,2.16 42.16,3.05 42.16,4.44 43.47,5.76 U10.6
KEY_LEFT: length 47.1
  Top Layer w0.254: U10.5 41.57,1.65 27.56,1.65 24.26,4.95 11.81,4.95 9.53,7.24 9.53,8 7.62,9.91 7.62,11.55 U5.1
KEY_RIGHT: length 30.4
  Top Layer w0.254: U10.4 40.93,11.77 40.39,12.32 31.88,12.32 26.92,17.27 21.91,17.27 19.46,14.82
KEY_UP: length 43.9
  Top Layer w0.254: U10.3 40.93,3.98 42.16,5.21 42.16,12.19 41.15,13.21 32.26,13.21 24.51,20.95 13.7,20.95 U4.1
MOTOR-VCC: length 24.1
  Top Layer w1.27: 开关1.3 8.64,43.31 8.64,35.81 11.43,33.02 U8.4 13.16,32.94 U12.2
$1N706: length 15.2
  Top Layer w1.27: 开关1.2 4.83,40.26 6.3,38.79 电源1.1
$1N1740: length 99.7
  Top Layer w1.27: U9.6 84.36,67.34 81.66,64.64 81.66,50.16 78.36,46.86 36.96,46.86 25.65,35.56 ; U8.6 25.65,35.56 ; 25.65,35.56 23.11,33.02 U8.5
$1N1765: length 82
  Top Layer w1.27: U8.8 U8.7
  Bottom Layer w1.27: U8.7 26.16,38.1 35.56,47.5 86.23,47.5 92.71,53.97 U9.1

# Board V1.0.1-PCB
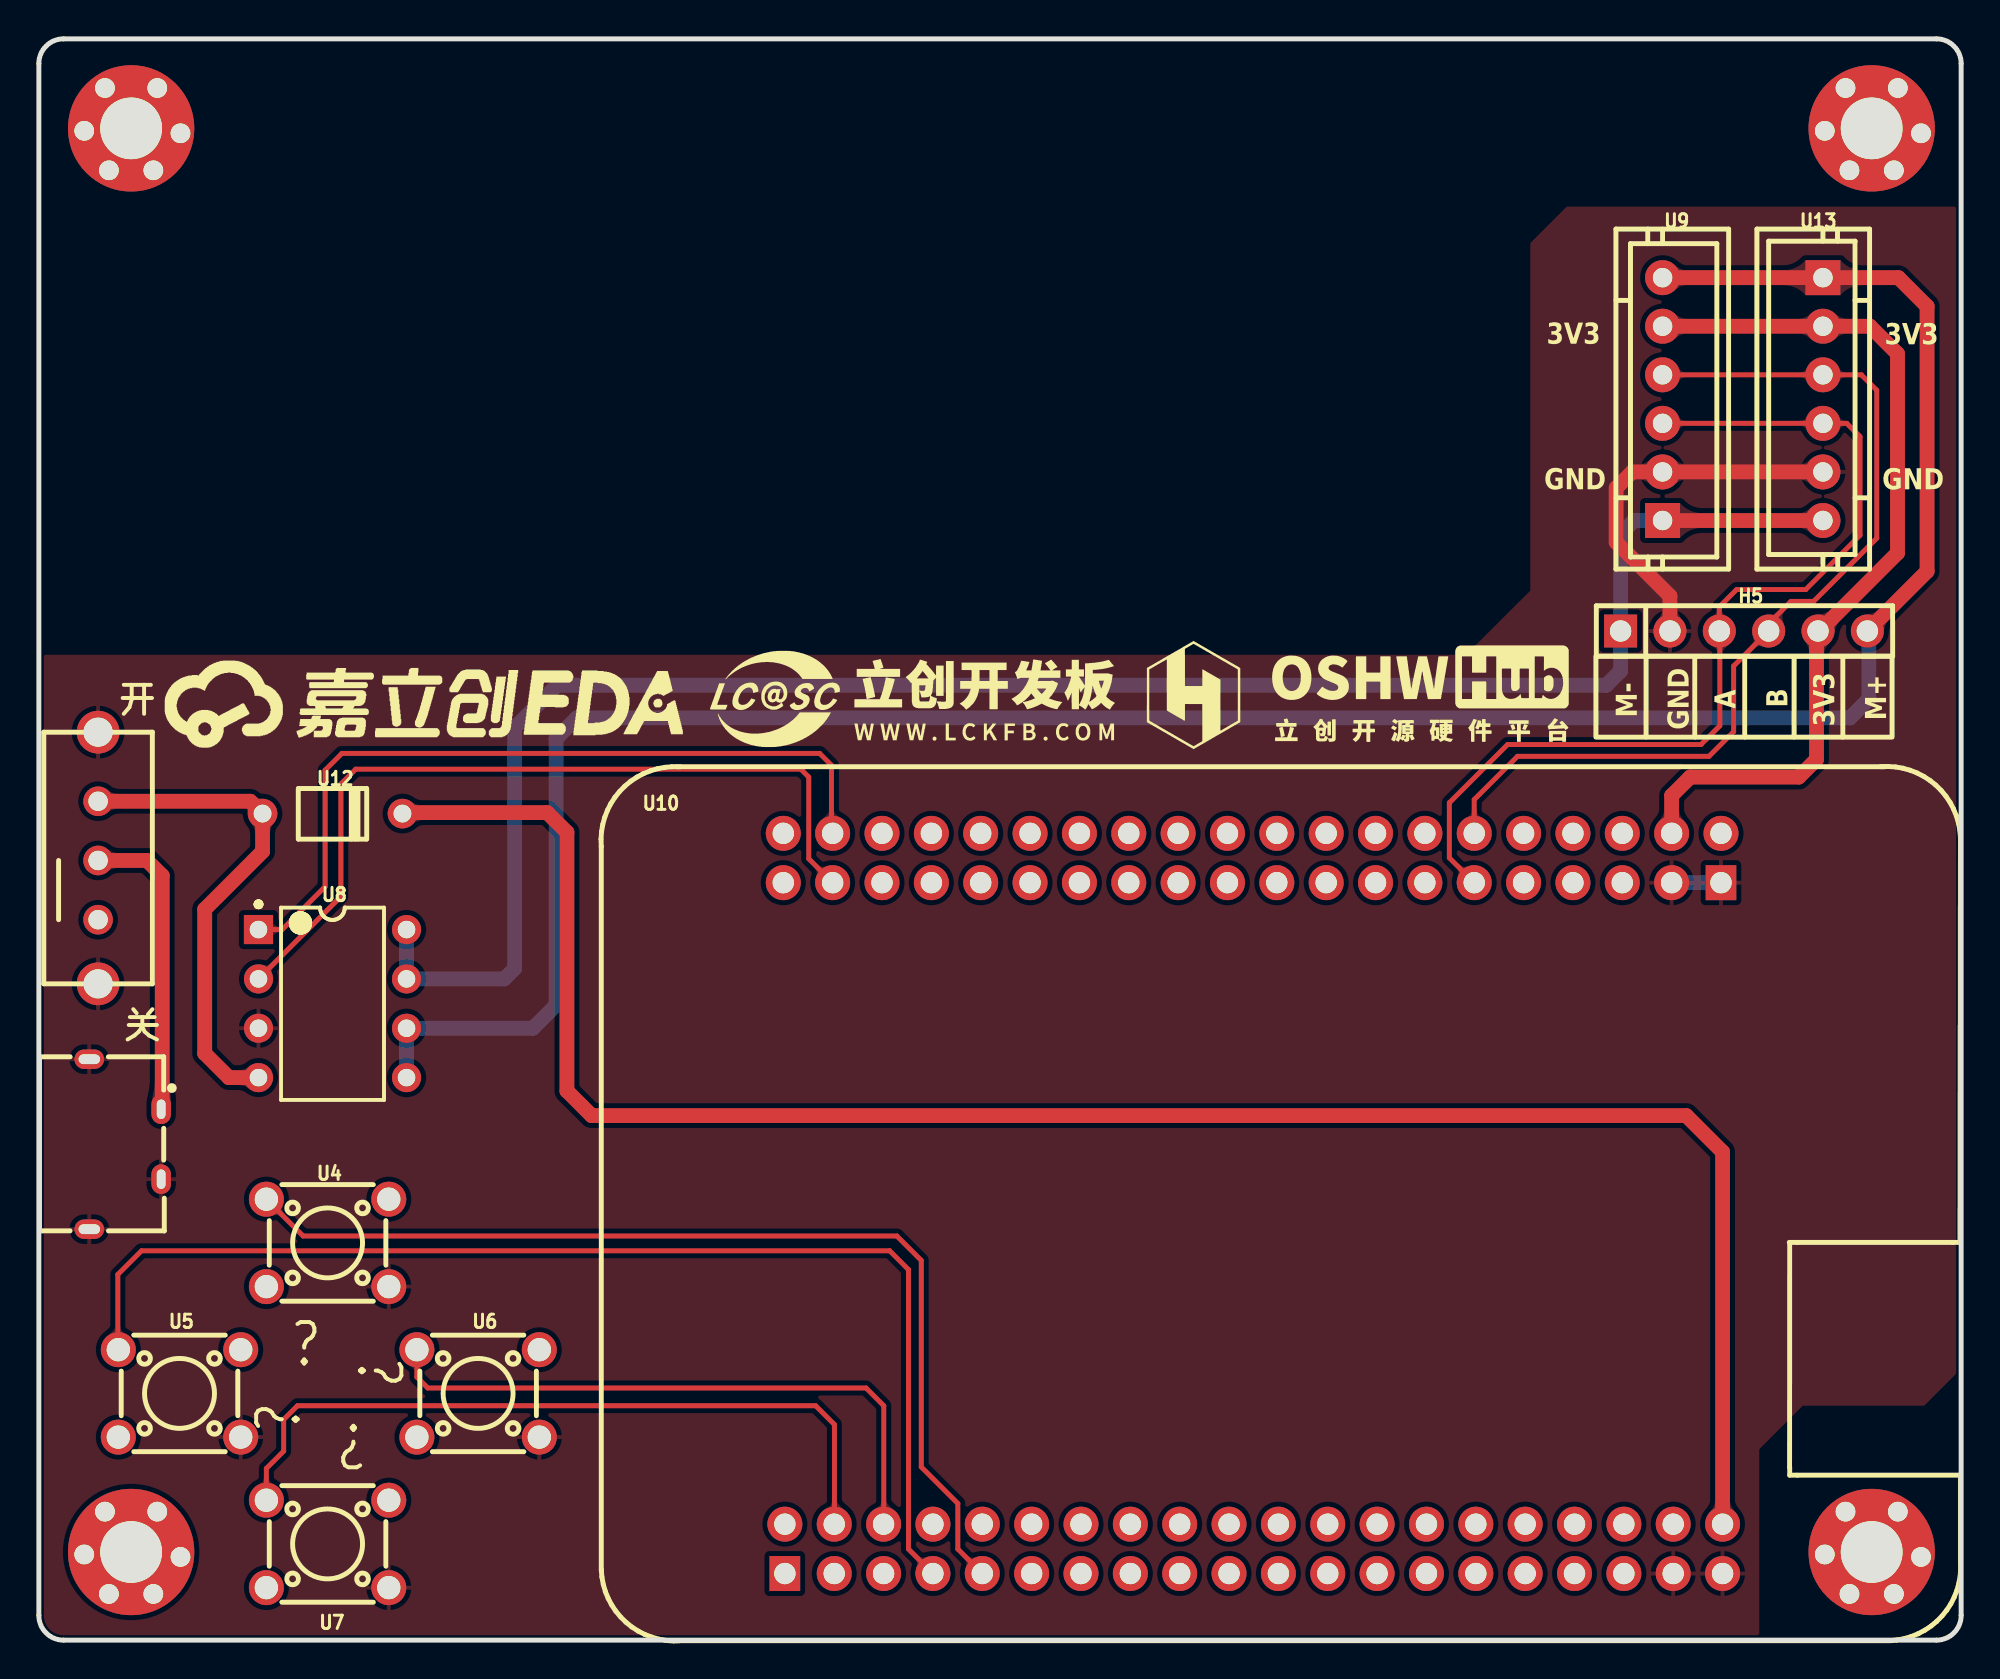
[diagram p5: board, top side]
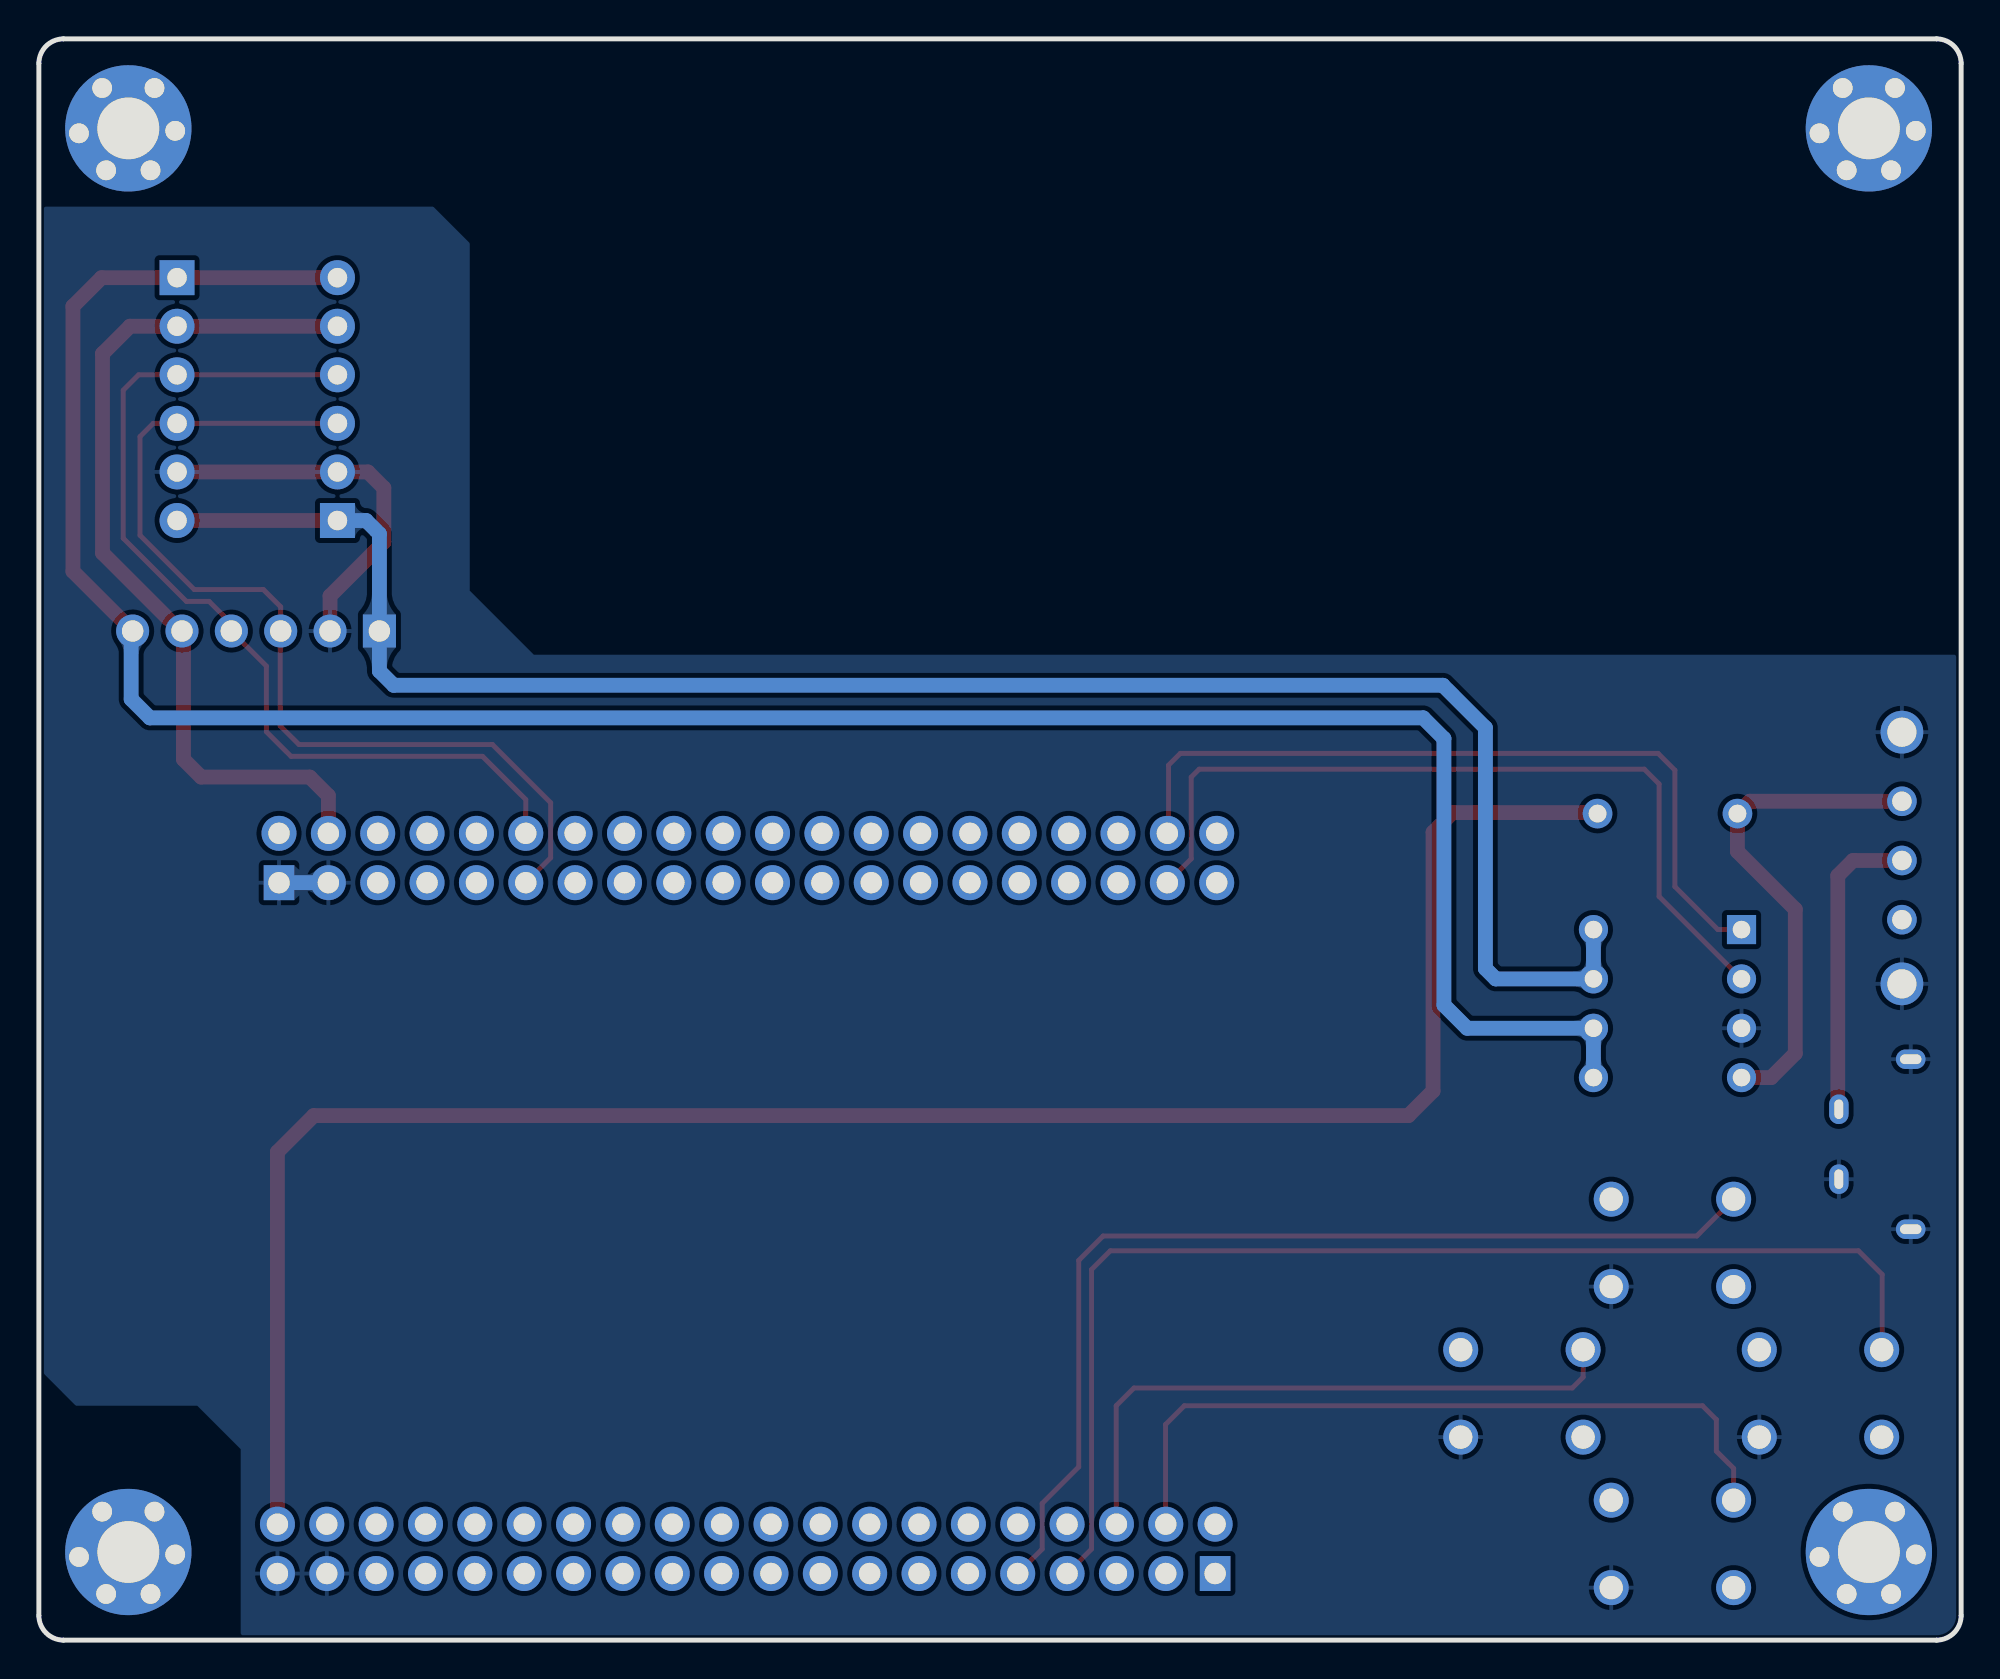
[diagram p6: board, bottom side, seen from below]

Outline 98.93 x 82.42 mm; copper layers: Top Layer, Bottom Layer. Coordinates in mm from the lower left corner of the outline.
Outline path: 0,81.15 0,1.27 arc(0.37,0.37) 1.27,0 97.66,0 arc(98.56,0.37) 98.93,1.27 98.93,81.15 arc(98.56,82.05) 97.66,82.42 1.27,82.42 arc(0.37,82.05) 0,81.15
Stack: Top Layer 0.035mm / Dielectric1 1.51mm FR4 er 4.5 / Bottom Layer 0.035mm

## Design rules (mm)
spacing copperThickness1oz (default): track to track 0.102, other pairs 0.152 to 0.3
spacing copperThickness2oz: track to track 0.203, other pairs 0.152 to 0.3
spacing Plane_innerPlane: track to track 0.102, other pairs 0.152 to 0.3
spacing Copper_copperRegion: track to track 0.102, other pairs 0.152 to 0.3
track width copperThickness1oz (default): min 0.127, default 0.254, max 2.54
track width copperThickness2oz: min 0.203, default 0.254, max 2.54
differential pair differentialPair (default): width min 0.127, default 0.254, max 2.54; gap min 0.152, default 0.152
pour e148 uses Copper_copperRegion
pour e214 uses Copper_copperRegion

## Placement (name value [footprint] x y rotation side)
H1  M3  [m3 125x300]  4.75 4.54 0 top
H2  M3  [m3 125x300]  4.75 77.82 0 top
H3  M3  [m3 125x300]  94.33 77.82 0 top
H4  M3  [m3 125x300]  94.33 4.54 0 top
H5  PZ254V-11-06P  [HDR-TH_6P-P2.54-V-M]  87.76 51.94 0 top
U4  ZX-QC66-8.5CJ  [SW-TH_4P-L6.0-W6.0-P4.50-LS6.3]  14.86 20.45 0 top
U5  ZX-QC66-8.5CJ  [SW-TH_4P-L6.0-W6.0-P4.50-LS6.3]  7.24 12.7 0 top
U6  ZX-QC66-8.5CJ  [SW-TH_4P-L6.0-W6.0-P4.50-LS6.3]  22.61 12.7 0 top
U7  ZX-QC66-8.5CJ  [SW-TH_4P-L6.0-W6.0-P4.50-LS6.3]  14.86 4.95 0 top
U8  BDR6126D  [DIP-8_L9.3-W6.4-P2.54-LS7.6-BL-1]  15.11 32.77 270 top
U9  2.54mm-6P ZZ  [CONN-TH_6P-P2.50_HCTL_XH-6A_C2908604]  83.57 63.88 90 top
U10  LCKFB-TMX-MSPM0G3507  [COMM-TH_LCKFB-TMX-MSPM0G3507]  62.48 22.48 90 top
U11  -  [TT马达]  39.5 66.29 90 top
U12  D7G-T  [DIO-TH_BD2.4-L3.2-P7.20-D0.8-RD]  15.11 42.55 180 top
U13  2.54mm-6P ZZ  [CONN-TH_6P-P2.50_HCTL_XH-6A_C2908604]  91.82 63.88 270 top
开关1  SK-12E12-G5  [SW-TH_SK-12E12-G5]  3.05 40.26 180 top
电源1  KH-TYPE-C-2P  [USB-SMD_KH-TYPE-C-2P]  4.45 25.53 270 top

## Footprints (pads in the part's own frame, mm; a bottom-side part is the same pattern mirrored in y, then rotated)
COMM-TH_LCKFB-TMX-MSPM0G3507
  rect 1.8x1.575 hole 1.1: 1(-19.05,24.09) 41(16.51,-24.09)
  round 1.8 hole 1.1: 2(-16.51,24.09) 3(-19.05,21.549) 4(-16.51,21.549) 5(-19.05,19.009) 6(-16.51,19.009) 7(-19.05,16.47) 8(-16.51,16.47) 9(-19.05,13.93) 10(-16.51,13.93) 11(-19.05,11.389) 12(-16.51,11.389) 13(-19.05,8.85) 14(-16.51,8.85) 15(-19.05,6.309) 16(-16.51,6.309) 17(-19.05,3.769) 18(-16.51,3.769) 19(-19.05,1.23) 20(-16.51,1.23) 21(-19.05,-1.31) 22(-16.51,-1.31) 23(-19.05,-3.85) 24(-16.51,-3.85) 25(-19.05,-6.391) 26(-16.51,-6.391) 27(-19.05,-8.931) 28(-16.51,-8.931) 29(-19.05,-11.47) 30(-16.51,-11.47) 31(-19.05,-14.011) 32(-16.51,-14.011) 33(-19.05,-16.55) 34(-16.51,-16.55) 35(-19.05,-19.09) 36(-16.51,-19.09) 37(-19.05,-21.631) 38(-16.51,-21.631) 39(-19.05,-24.171) 40(-16.51,-24.171) 42(19.05,-24.09) 43(16.51,-21.549) 44(19.05,-21.549) 45(16.51,-19.009) 46(19.05,-19.009) 47(16.51,-16.47) 48(19.05,-16.47) 49(16.51,-13.93) 50(19.05,-13.93) 51(16.51,-11.389) 52(19.05,-11.389) 53(16.51,-8.85) 54(19.05,-8.85) 55(16.51,-6.309) 56(19.05,-6.309) 57(16.51,-3.769) 58(19.05,-3.769) 59(16.51,-1.23) 60(19.05,-1.23) 61(16.51,1.31) 62(19.05,1.31) 63(16.51,3.85) 64(19.05,3.85) 65(16.51,6.391) 66(19.05,6.391) 67(16.51,8.931) 68(19.05,8.931) 69(16.51,11.47) 70(19.05,11.47) 71(16.51,14.011) 72(19.05,14.011) 73(16.51,16.55) 74(19.05,16.55) 75(16.51,19.09) 76(19.05,19.09) 77(16.51,21.631) 78(19.05,21.631) 79(16.51,24.171) 80(19.05,24.171)
CONN-TH_6P-P2.50_HCTL_XH-6A_C2908604
  rect 1.8x1.8 hole 1: 1(-6.25,0.001)
  round 1.8 hole 1: 2(-3.749,0.001) 3(-1.25,0.001) 4(1.25,0) 5(3.75,-0.001) 6(6.25,-0.001)
DIO-TH_BD2.4-L3.2-P7.20-D0.8-RD
  round 1.524 hole 0.914: 1(-3.6,0) 2(3.6,0)
DIP-8_L9.3-W6.4-P2.54-LS7.6-BL-1
  rect 1.5x1.5 hole 0.9: 1(-3.81,-3.81)
  round 1.5 hole 0.9: 2(-1.27,-3.81) 3(1.27,-3.81) 4(3.81,-3.81) 5(3.81,3.81) 6(1.27,3.81) 7(-1.27,3.81) 8(-3.81,3.81)
HDR-TH_6P-P2.54-V-M
  rect 1.7x1.7 hole 1.1: 1(-6.35,0)
  round 1.7 hole 1.1: 2(-3.81,0) 3(-1.27,0) 4(1.27,0) 5(3.81,0) 6(6.35,0)
m3 125x300
  round 1.016 hole 1.021x1.016: 1(-2.413,-0.127) 1(-1.346,2.078) 1(-1.143,-2.159) 1(1.143,-2.159) 1(1.346,2.078) 1(2.54,-0.254)
  round 6.5 hole 3.18x3.175: 1(0,0)
SW-TH_4P-L6.0-W6.0-P4.50-LS6.3
  round 1.8 hole 1.2: 1(-3.15,2.25) 2(3.15,2.25) 3(-3.15,-2.25) 4(3.15,-2.25)
SW-TH_SK-12E12-G5
  round 1.524 hole 1: 1(0,3.175) 2(0,0.127) 3(0,-2.921)
  round 2.2 hole 1.5: 4(0,-6.477) 5(0,6.477)
USB-SMD_KH-TYPE-C-2P
  oval 1.524x1 hole 1x0.45: 1(-1.8,1.85) 2(1.8,1.85)
  oval 1x1.524 hole 0.5x1.1: 3(4.375,-1.85) 4(-4.375,-1.85)

## Nets
As in the schematic.

Pads without a net: H1 1; H2 1; H3 1; H4 1; U4 2 3; U5 2 3; U6 2 3; U7 2 3; U10 1 2 3 5 8 10 11 12 13 14 15 16 17 18 19 20 21 22 23 24 25 26 27 28 29 30 31 32 33 34 35 36 38 42 45 46 47 48 49 50 53 54 55 56 57 58 59 60 61 62 63 64 65 66 67 68 69 70 71 72 73 74 75 76 79 80; 开关1 1

## Routing (per net, layer and track width the routed paths; a pad name or vN(x,y) marks a point on that pad's centre or on a via; arc(x,y) is an arc through that point)
3V3: length 45.5
  Top Layer w0.762: 83.57,67.63 U13.2 94.24,67.63 95.66,66.22 95.66,55.96 91.64,51.94 H5.5 91.49,51.87 91.49,45.34 90.58,44.42 84.99,44.42 84.03,43.47 U10.44
+5V: length 102.2
  Top Layer w0.762: U10.40 86.65,25.13 84.79,27 28.45,27 27.18,28.27 27.18,41.58 26.16,42.6 18.76,42.6 U12.1
GND: length 22
  Top Layer w0.762: 83.95,51.94 83.95,53.75 81.18,56.52 81.18,59.31 82,60.13 U9.2 U13.5
  Bottom Layer w0.762: U10.43 U10.41
BI: length 40.5
  Top Layer w0.254: 11.3,36.58 12.52,36.58 14.73,38.79 14.73,44.78 15.6,45.64 40.18,45.64 40.79,45.03 40.79,41.59 U10.78
ENCODER-A: length 50.6
  Top Layer w0.254: U10.51 72.59,40.27 72.59,43.1 75.59,46.1 85.55,46.1 86.51,47.07 86.51,51.92 86.49,51.94 86.49,53.19 87.38,54.08 90.93,54.08 93.73,56.87 93.73,61.95 93.05,62.63 U13.4 U9.3
ENCODER-B: length 49.2
  Top Layer w0.254: U10.52 73.87,43.27 76.1,45.49 85.95,45.49 87.22,46.76 87.22,50.14 H5.4 89.03,52.32 90.17,53.47 91.34,53.47 94.59,56.72 94.59,64.34 93.8,65.13 U13.3 83.57,65.13
FI: length 42.3
  Top Layer w0.254: U8.2 15.55,38.28 15.55,44.07 16.31,44.83 39.22,44.83 39.62,44.42 39.62,40.22 U10.77
KEY_DOWN: length 38.7
  Top Layer w0.254: U10.4 40.95,5.98 40.95,11.1 39.98,12.07 13.31,12.07 12.6,11.35 12.6,9.73 11.71,8.84 U7.1
KEY_LEFT: length 61.6
  Top Layer w0.254: U5.1 4.06,14.98 4.06,18.82 5.28,20.04 43.79,20.04 44.76,19.08 44.76,4.69 U10.7
KEY_RIGHT: length 32.2
  Top Layer w0.254: U10.6 43.48,5.98 43.48,12.07 42.57,12.98 20.02,12.98 19.46,13.54 U6.1
KEY_UP: length 52.4
  Top Layer w0.254: U4.1 13.6,20.8 44.16,20.8 45.42,19.55 45.42,8.92 47.3,7.04 47.3,4.69 U10.9
MOTOR-VCC: length 25.6
  Top Layer w0.762: U8.4 9.78,28.96 8.53,30.2 8.53,37.62 11.51,40.6 U12.2 10.88,43.18 开关1.3
$1N706: length 15.7
  Top Layer w0.762: 开关1.2 5.56,40.13 6.35,39.34 6.35,27.38 电源1.1
$1N1740: length 128.6
  Top Layer w0.762: 91.82,70.13 95.71,70.13 97.18,68.66 97.18,55.02 94.11,51.94 ; U9.6 U13.1
  Bottom Layer w0.762: U8.5 18.92,31.5 25.43,31.5 26.62,32.69 26.62,46.41 27.69,47.47 93.22,47.47 94.18,48.44 94.18,51.87 94.11,51.94
$1N1765: length 96.6
  Top Layer w0.762: U9.1 U13.6
  Bottom Layer w0.762: U9.1 82.09,57.63 81.41,56.95 H5.1 81.41,49.89 80.67,49.15 26.67,49.15 24.49,46.96 24.49,34.57 23.95,34.04 U8.7 18.92,36.58

## Copper pours and planes (outline as drawn; the poured copper is in the pictures)
GND on Top Layer: -7.87,50.72 73.46,50.72 76.76,54.03 76.76,71.91 78.64,73.79 98.91,73.79 100.06,72.63 100.06,15.1 97.03,12.07 90.78,12.07 88.54,9.83 88.54,-0.79 87.94,-1.4 -5.33,-1.4 -7.87,1.14
GND on Bottom Layer: -7.87,50.72 73.46,50.72 76.76,54.03 76.76,71.91 78.64,73.79 98.91,73.79 100.06,72.63 100.06,15.1 97.03,12.07 90.78,12.07 88.54,9.83 88.54,-0.79 87.94,-1.4 -5.33,-1.4 -7.87,1.14

Small or netless copper shapes (teardrops, artwork), in the pictures only: 48 on Top Layer, 12 on Bottom Layer

## Text on the board
Document Layer: 1.9寸 SPI彩屏
Top Silkscreen Layer: 开 | 关 | 🔺 | GND | 3V3 | M- | A | B | M+

# Board V1.0.2-PCB
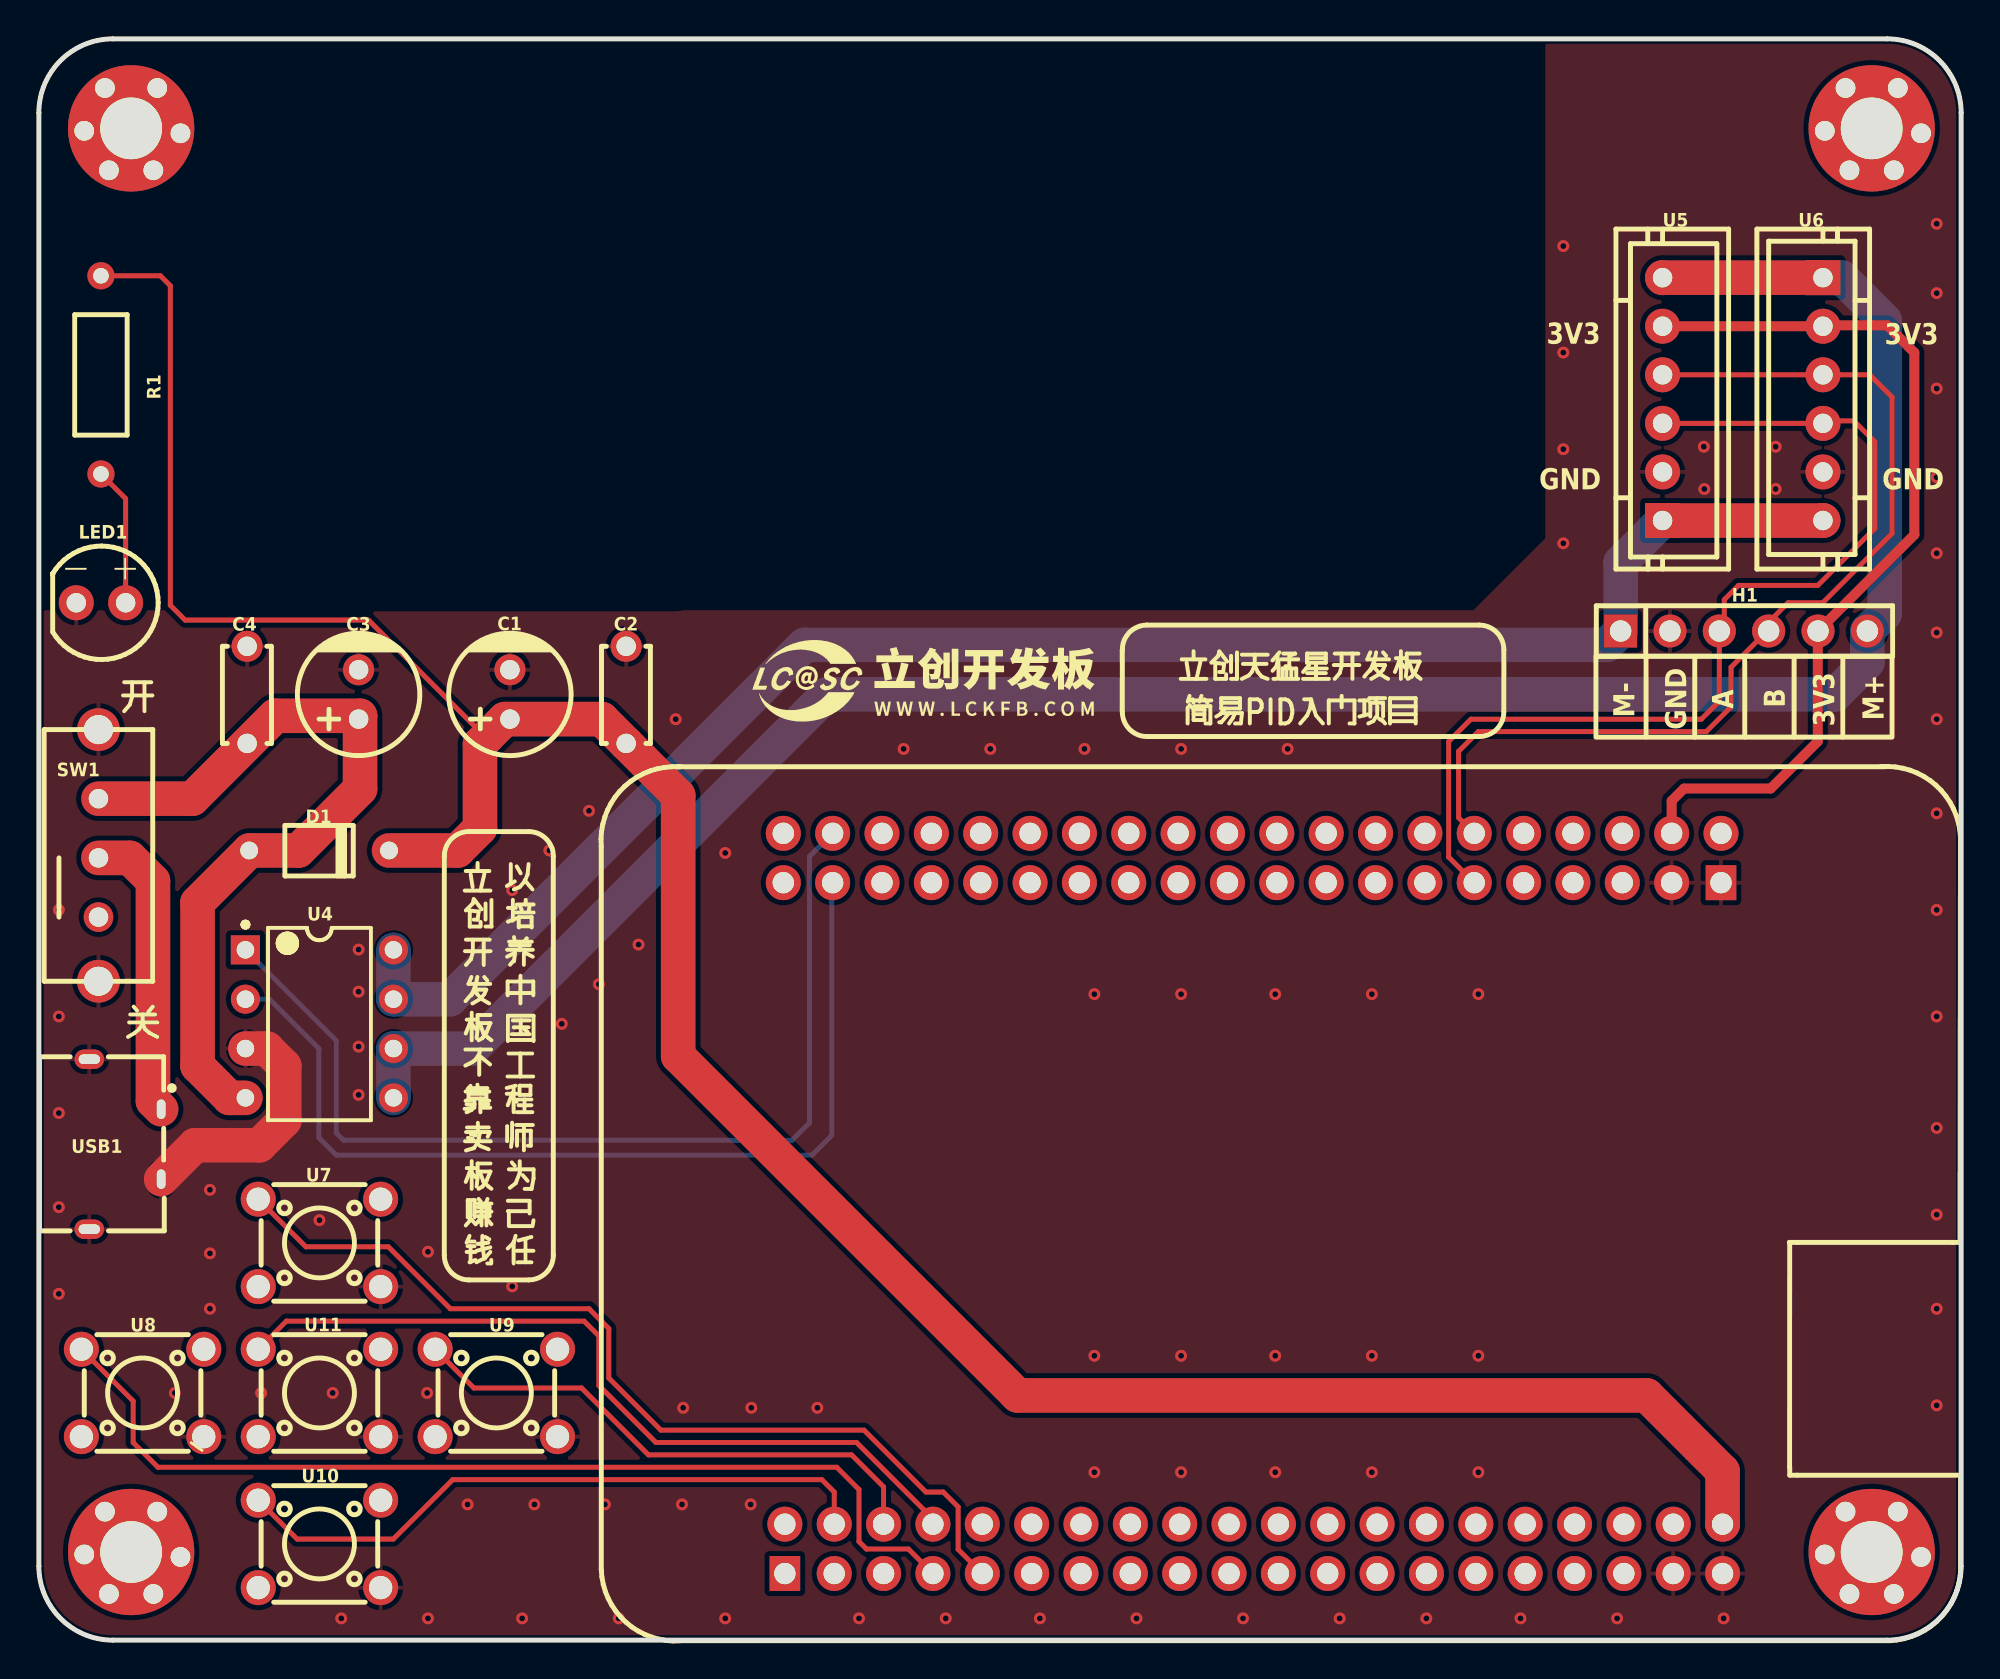
[diagram p7: board, top side]
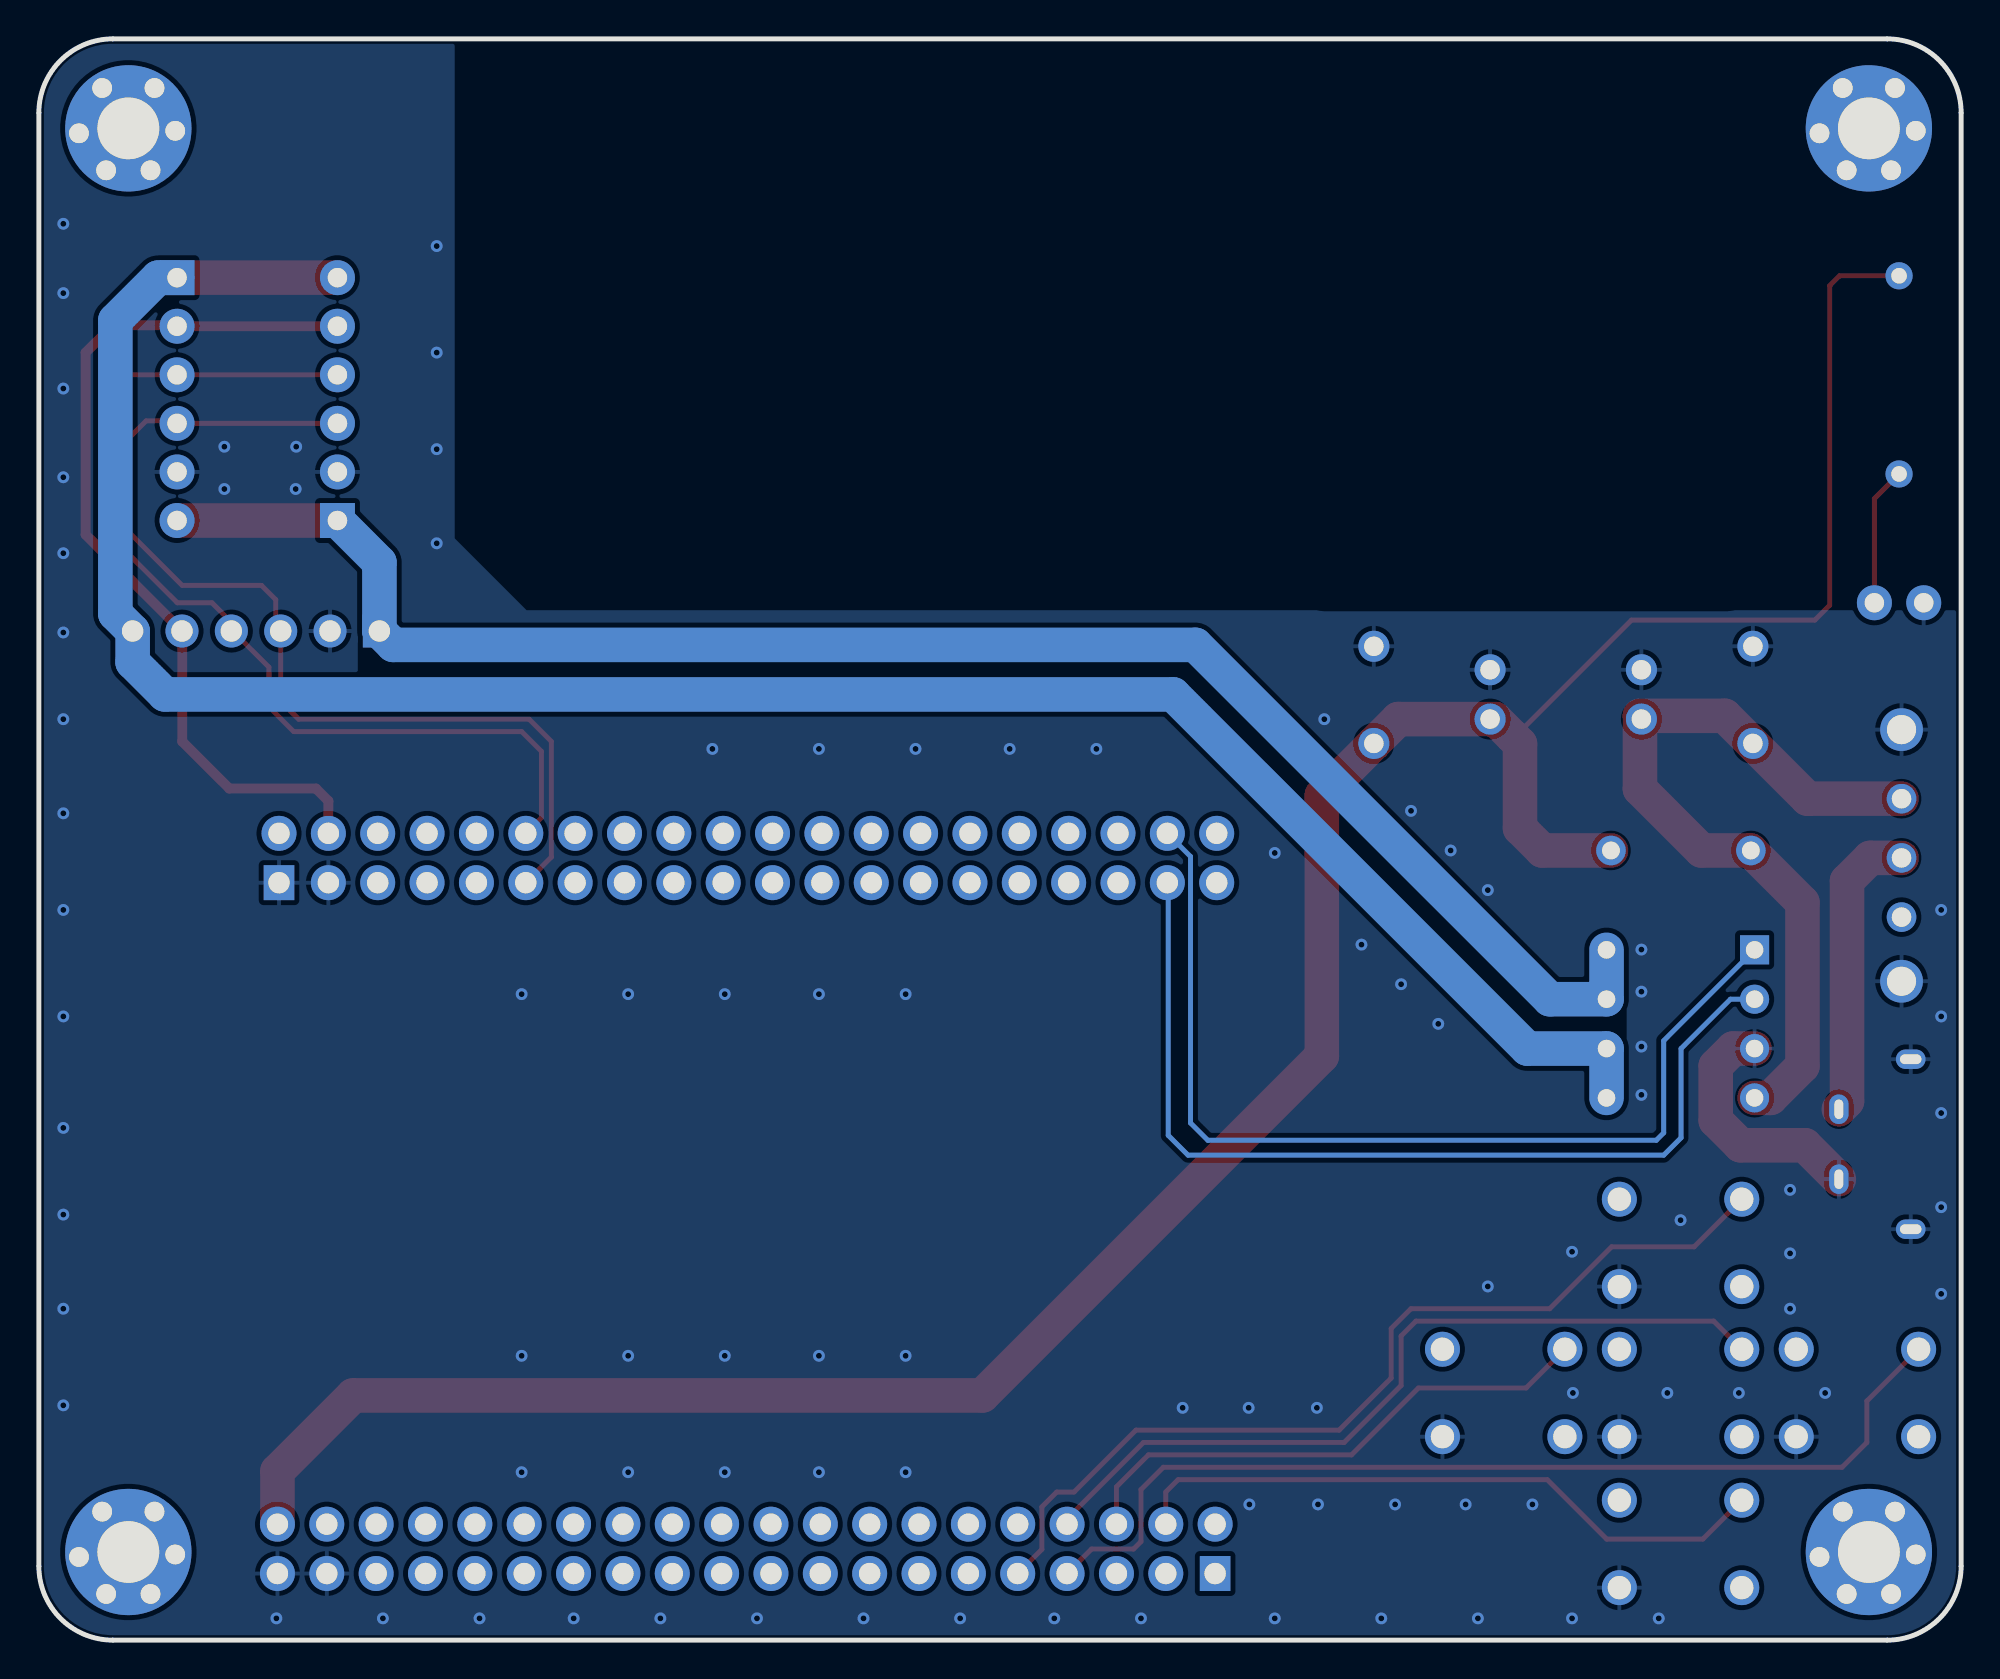
[diagram p8: board, bottom side, seen from below]

Outline 98.93 x 82.42 mm; copper layers: Top Layer, Bottom Layer. Coordinates in mm from the lower left corner of the outline.
Outline path: 0,78.61 0,3.81 arc(1.12,1.12) 3.81,0 95.12,0 arc(97.82,1.12) 98.93,3.81 98.93,78.61 arc(97.82,81.31) 95.12,82.42 3.81,82.42 arc(1.12,81.31) 0,78.61
Stack: Top Layer 0.035mm / Dielectric1 1.51mm FR4 er 4.5 / Bottom Layer 0.035mm

## Design rules (mm)
spacing copperThickness1oz (default): track to track 0.102, other pairs 0.152 to 0.3
spacing copperThickness2oz: track to track 0.203, other pairs 0.152 to 0.3
spacing Plane_innerPlane: track to track 0.102, other pairs 0.152 to 0.3
spacing Copper_copperRegion: track to track 0.102, other pairs 0.152 to 0.3
track width copperThickness1oz (default): min 0.127, default 0.254, max 2.54
track width copperThickness2oz: min 0.203, default 0.254, max 2.54
differential pair differentialPair (default): width min 0.127, default 0.254, max 2.54; gap min 0.152, default 0.152
pour e271 uses Copper_copperRegion
pour e354 uses Copper_copperRegion

## Placement (name value [footprint] x y rotation side)
C1  22uF  [CAP-TH_BD6.3-P2.50-D1.0-FD]  24.24 48.68 90 top
C2  100nF  [CAP-TH_L5.0-W2.5-P5.00-D1.0]  30.23 48.66 270 top
C3  22uF  [CAP-TH_BD6.3-P2.50-D1.0-FD]  16.46 48.68 90 top
C4  100nF  [CAP-TH_L5.0-W2.5-P5.00-D1.0]  10.72 48.66 270 top
D1  D7G-T  [DIO-TH_BD2.4-L3.2-P7.20-D0.8-RD]  14.42 40.65 180 top
H1  PZ254V-11-06P  [HDR-TH_6P-P2.54-V-M]  87.76 51.94 0 top
H2  M3  [m3 125x300]  4.75 4.54 0 top
H3  M3  [m3 125x300]  4.75 77.82 0 top
H4  M3  [m3 125x300]  94.33 77.82 0 top
H5  M3  [m3 125x300]  94.33 4.54 0 top
LED1  XL-502SURD  [LED-TH_BD5.9-P2.54-RD_RED]  3.2 53.4 0 top
R1  1kΩ  [RES-TH_BD2.7-L6.2-P10.20-D0.4]  3.2 65.13 270 top
SW1  SK-12E12-G5  [SW-TH_SK-12E12-G5]  3.07 40.39 180 top
U1  LCKFB-TMX-MSPM0G3507  [COMM-TH_LCKFB-TMX-MSPM0G3507]  62.48 22.48 90 top
U4  BDR6126D  [DIP-8_L9.3-W6.4-P2.54-LS7.6-BL-1]  14.44 31.72 270 top
U5  2.54mm-6P ZZ  [CONN-TH_6P-P2.50_HCTL_XH-6A_C2908604]  83.57 63.88 90 top
U6  2.54mm-6P ZZ  [CONN-TH_6P-P2.50_HCTL_XH-6A_C2908604]  91.82 63.88 270 top
U7  ZX-QC66-8.5CJ  [SW-TH_4P-L6.0-W6.0-P4.50-LS6.3]  14.44 20.45 0 top
U8  ZX-QC66-8.5CJ  [SW-TH_4P-L6.0-W6.0-P4.50-LS6.3]  5.34 12.72 0 top
U9  ZX-QC66-8.5CJ  [SW-TH_4P-L6.0-W6.0-P4.50-LS6.3]  23.55 12.72 0 top
U10  ZX-QC66-8.5CJ  [SW-TH_4P-L6.0-W6.0-P4.50-LS6.3]  14.44 4.95 0 top
U11  ZX-QC66-8.5CJ  [SW-TH_4P-L6.0-W6.0-P4.50-LS6.3]  14.44 12.72 0 top
U13  -  [TT马达]  47.18 67.55 270 top
USB1  KH-TYPE-C-2P  [USB-SMD_KH-TYPE-C-2P]  4.45 25.53 270 top

## Footprints (pads in the part's own frame, mm; a bottom-side part is the same pattern mirrored in y, then rotated)
CAP-TH_BD6.3-P2.50-D1.0-FD
  round 1.6 hole 1: 1(-1.27,0) 2(1.27,0)
CAP-TH_L5.0-W2.5-P5.00-D1.0
  round 1.6 hole 1: 1(-2.5,0) 2(2.5,0)
COMM-TH_LCKFB-TMX-MSPM0G3507
  rect 1.8x1.575 hole 1.1: 1(-19.05,24.09) 41(16.51,-24.09)
  round 1.8 hole 1.1: 2(-16.51,24.09) 3(-19.05,21.549) 4(-16.51,21.549) 5(-19.05,19.009) 6(-16.51,19.009) 7(-19.05,16.47) 8(-16.51,16.47) 9(-19.05,13.93) 10(-16.51,13.93) 11(-19.05,11.389) 12(-16.51,11.389) 13(-19.05,8.85) 14(-16.51,8.85) 15(-19.05,6.309) 16(-16.51,6.309) 17(-19.05,3.769) 18(-16.51,3.769) 19(-19.05,1.23) 20(-16.51,1.23) 21(-19.05,-1.31) 22(-16.51,-1.31) 23(-19.05,-3.85) 24(-16.51,-3.85) 25(-19.05,-6.391) 26(-16.51,-6.391) 27(-19.05,-8.931) 28(-16.51,-8.931) 29(-19.05,-11.47) 30(-16.51,-11.47) 31(-19.05,-14.011) 32(-16.51,-14.011) 33(-19.05,-16.55) 34(-16.51,-16.55) 35(-19.05,-19.09) 36(-16.51,-19.09) 37(-19.05,-21.631) 38(-16.51,-21.631) 39(-19.05,-24.171) 40(-16.51,-24.171) 42(19.05,-24.09) 43(16.51,-21.549) 44(19.05,-21.549) 45(16.51,-19.009) 46(19.05,-19.009) 47(16.51,-16.47) 48(19.05,-16.47) 49(16.51,-13.93) 50(19.05,-13.93) 51(16.51,-11.389) 52(19.05,-11.389) 53(16.51,-8.85) 54(19.05,-8.85) 55(16.51,-6.309) 56(19.05,-6.309) 57(16.51,-3.769) 58(19.05,-3.769) 59(16.51,-1.23) 60(19.05,-1.23) 61(16.51,1.31) 62(19.05,1.31) 63(16.51,3.85) 64(19.05,3.85) 65(16.51,6.391) 66(19.05,6.391) 67(16.51,8.931) 68(19.05,8.931) 69(16.51,11.47) 70(19.05,11.47) 71(16.51,14.011) 72(19.05,14.011) 73(16.51,16.55) 74(19.05,16.55) 75(16.51,19.09) 76(19.05,19.09) 77(16.51,21.631) 78(19.05,21.631) 79(16.51,24.171) 80(19.05,24.171)
CONN-TH_6P-P2.50_HCTL_XH-6A_C2908604
  rect 1.8x1.8 hole 1: 1(-6.25,0.001)
  round 1.8 hole 1: 2(-3.749,0.001) 3(-1.25,0.001) 4(1.25,0) 5(3.75,-0.001) 6(6.25,-0.001)
DIO-TH_BD2.4-L3.2-P7.20-D0.8-RD
  round 1.524 hole 0.914: 1(-3.6,0) 2(3.6,0)
DIP-8_L9.3-W6.4-P2.54-LS7.6-BL-1
  rect 1.5x1.5 hole 0.9: 1(-3.81,-3.81)
  round 1.5 hole 0.9: 2(-1.27,-3.81) 3(1.27,-3.81) 4(3.81,-3.81) 5(3.81,3.81) 6(1.27,3.81) 7(-1.27,3.81) 8(-3.81,3.81)
HDR-TH_6P-P2.54-V-M
  rect 1.7x1.7 hole 1.1: 1(-6.35,0)
  round 1.7 hole 1.1: 2(-3.81,0) 3(-1.27,0) 4(1.27,0) 5(3.81,0) 6(6.35,0)
LED-TH_BD5.9-P2.54-RD_RED
  round 1.8 hole 1: 1(-1.27,0) 2(1.27,0)
m3 125x300
  round 1.016 hole 1.021x1.016: 1(-2.413,-0.127) 1(-1.346,2.078) 1(-1.143,-2.159) 1(1.143,-2.159) 1(1.346,2.078) 1(2.54,-0.254)
  round 6.5 hole 3.18x3.175: 1(0,0)
RES-TH_BD2.7-L6.2-P10.20-D0.4
  round 1.4 hole 0.8: 1(-5.1,0) 2(5.1,0)
SW-TH_4P-L6.0-W6.0-P4.50-LS6.3
  round 1.8 hole 1.2: 1(-3.15,2.25) 2(3.15,2.25) 3(-3.15,-2.25) 4(3.15,-2.25)
SW-TH_SK-12E12-G5
  round 1.524 hole 1: 1(0,3.175) 2(0,0.127) 3(0,-2.921)
  round 2.2 hole 1.5: 4(0,-6.477) 5(0,6.477)
USB-SMD_KH-TYPE-C-2P
  oval 1.524x1 hole 1x0.45: 1(-1.8,1.85) 2(1.8,1.85)
  oval 1x1.524 hole 0.5x1.1: 3(4.375,-1.85) 4(-4.375,-1.85)

## Nets
As in the schematic.

Pads without a net: H2 1; H3 1; H4 1; H5 1; SW1 1; U1 1 2 3 5 10 11 12 13 14 15 16 17 18 19 20 21 22 23 24 25 26 27 28 29 30 31 32 33 34 35 36 38 42 45 46 47 48 49 50 53 54 55 56 57 58 59 60 61 62 63 64 65 66 67 68 69 70 71 72 73 74 75 76 79 80; U7 2 3; U8 2 3; U9 2 3; U10 2 3; U11 2 3

## Via types
v1: diameter 0.61, hole 0.305, Top Layer to Bottom Layer, 92 vias

## Routing (per net, layer and track width the routed paths; a pad name or vN(x,y) marks a point on that pad's centre or on a via; arc(x,y) is an arc through that point)
3V3: length 46.1
  Top Layer w0.508: U1.44 84.03,41.53 84.03,43.2 84.67,43.83 89.13,43.83 91.55,46.26 91.55,51.93 H1.5 96.53,56.9 96.53,66.27 95.12,67.68 91.87,67.68 U6.2 83.57,67.63
+5V: length 140
  Top Layer w0.254: R1.1 6.26,70.23 6.77,69.72 6.77,53.27 7.53,52.5 16.97,52.5 22.94,46.53 23.11,46.53
  Top Layer w1.778: D1.1 21.56,40.65 22.7,41.79 22.7,46.13 23.11,46.53 23.98,47.41 28.97,47.41 C2.2 32.9,43.48 32.9,30.06 50.37,12.6 82.76,12.6 86.65,8.7 U1.40
GND: length 12.8
  Top Layer w1.778: U4.3 11.73,30.45 12.63,29.55 12.63,26.75 11.36,25.47 8.04,25.47 USB1.2
  vias: v1(1.03,37.59) v1(1.03,32.1) v1(1.03,27.13) v1(1.03,22.29) v1(1.03,17.82) v1(7,12.72) v1(8.81,23.18) v1(8.81,19.91) v1(8.81,17.06) v1(11.44,12.72) v1(14.44,21.62) v1(15.12,12.72) v1(15.56,1.12) v1(16.46,35.55) v1(16.46,33.38) v1(16.46,30.55) v1(16.46,28.07) v1(19.98,12.72) v1(20.03,19.99) v1(20.03,1.12) v1(22.07,6.99) v1(24.36,38.61) v1(24.36,18.21) v1(24.87,1.12) v1(25.5,6.99) v1(26.27,40.65) v1(26.91,31.72) v1(28.31,42.69) v1(28.82,33.76) v1(29.13,6.99) v1(29.84,1.12) v1(30.86,35.8) v1(32.78,47.4) v1(33.1,6.99) v1(33.16,11.96) v1(35.33,40.52) v1(35.33,1.12) v1(36.67,11.96) v1(36.63,6.99) v1(40.07,11.96) v1(42.21,1.12) v1(44.51,45.87) v1(46.67,1.12) v1(48.97,45.87) v1(51.52,1.12) v1(53.81,45.87) v1(54.32,33.25) v1(54.32,14.64) v1(54.32,8.64) v1(56.49,1.12) v1(58.79,45.87) v1(58.79,33.25) v1(58.79,14.64) v1(58.79,8.64) v1(61.97,1.12) v1(63.63,33.25) v1(63.63,14.64) v1(63.63,8.64) v1(64.27,45.87) v1(66.95,1.12) v1(68.6,33.25) v1(68.6,14.64) v1(68.6,8.64) v1(71.41,1.12) v1(74.09,33.25) v1(74.09,14.64) v1(74.09,8.64) v1(76.25,1.12) v1(78.46,71.76) v1(78.46,66.27) v1(78.46,61.3) v1(78.46,56.46) v1(81.23,1.12) v1(85.69,61.43) v1(85.72,59.25) v1(86.71,1.12) v1(89.39,61.43) v1(89.39,59.25) v1(97.67,72.9) v1(97.67,69.33) v1(97.67,64.42) v1(97.67,59.86) v1(97.67,55.95) v1(97.67,51.87) v1(97.67,47.4) v1(97.67,42.56) v1(97.67,37.59) v1(97.67,32.1) v1(97.67,26.37) v1(97.67,21.9) v1(97.67,17.06) v1(97.67,12.09)
BI: length 51.6
  Bottom Layer w0.254: U4.1 15.31,30.85 15.31,26.11 15.69,25.73 38.77,25.73 39.66,26.62 39.66,40.34 U1.78
ENCODER-A: length 53.1
  Top Layer w0.254: U1.51 72.56,40.31 72.56,46.26 73.7,47.4 85.56,47.4 86.49,48.33 86.49,51.94 86.74,52.2 86.74,53.56 87.47,54.29 91.55,54.29 94.49,57.22 94.49,61.68 93.41,62.76 91.95,62.76 U6.4 U5.3
ENCODER-B: length 52.3
  Top Layer w0.254: U1.52 73.07,42.34 73.07,45.75 74.09,46.77 85.82,46.77 87.09,48.04 87.09,50.08 88.95,51.94 H1.4 89.03,52.4 90.02,53.4 91.81,53.4 95.38,56.97 95.38,63.98 94.23,65.13 U6.3 U5.4
FI: length 49.6
  Bottom Layer w0.254: U1.77 40.81,38.94 40.81,25.98 39.79,24.96 15.31,24.96 14.42,25.86 14.42,30.45 11.87,32.99 U4.2
KEY_DOWN: length 33.7
  Top Layer w0.254: 40.94,5.97 40.94,7.62 40.3,8.26 21.3,8.26 18.24,5.2 13.29,5.2 U10.1
KEY_LEFT: length 51.4
  Top Layer w0.254: U8.1 4.85,12.31 4.85,10.17 6.13,8.9 41.06,8.9 42.21,7.75 42.21,5.07 42.59,4.69 44.75,4.69 U1.7
KEY_MID: length 41.3
  Top Layer w0.254: U11.1 12.74,16.42 28.06,16.42 28.82,15.66 28.82,13.11 31.76,10.17 42.08,10.17 46.01,6.24 U1.8
KEY_RIGHT: length 27.9
  Top Layer w0.254: U9.1 22.39,12.98 27.93,12.98 31.37,9.54 41.83,9.54 43.47,7.89 U1.6
KEY_UP: length 48
  Top Layer w0.254: U7.1 13.74,20.25 17.99,20.25 21.17,17.06 28.31,17.06 29.33,16.04 29.33,13.49 32.01,10.81 42.47,10.81 45.65,7.62 46.55,7.62 47.31,6.86 47.31,4.67 U1.9
MOTOR-VCC: length 41.3
  Top Layer w1.778: SW1.3 7.9,43.31 12.17,47.58 16.53,47.58 16.53,43.82 13.36,40.65 10.85,40.65 8.17,37.97 8.17,29.55 9.81,27.91 U4.4
$1N706: length 15.2
  Top Layer w1.778: SW1.2 4.69,40.26 5.87,39.08 5.87,27.75 USB1.1
$1N1740: length 116.9
  Top Layer w1.778: U6.1 U5.6
  Bottom Layer w1.778: U6.1 92.8,70.13 95,67.93 95,52.83 94.11,51.94 94.11,50.34 92.45,48.68 40.55,48.68 22.33,30.45 U4.6 U4.5
$1N1765: length 88.4
  Top Layer w1.778: U5.1 U6.6
  Bottom Layer w1.778: U4.8 U4.7 21.17,32.99 39.41,51.23 80.69,51.23 H1.1 81.41,55.47 U5.1
$1N10337: length 7.2
  Top Layer w0.254: LED1.2 4.47,58.76 R1.2

## Copper pours and planes (outline as drawn; the poured copper is in the pictures)
GND on Top Layer: -3.05,53.01 73.83,53.01 77.53,56.71 77.53,82.85 77.66,82.98 98.44,82.98 100.35,81.06 100.35,-0.41 99.2,-1.56 -3.05,-1.56
GND on Bottom Layer: -3.05,53.01 73.83,53.01 77.53,56.71 77.53,82.85 77.66,82.98 98.44,82.98 100.35,81.06 100.35,-0.41 99.2,-1.56 -3.05,-1.56

## Text on the board
Document Layer: 1.9寸 SPI彩屏
Top Silkscreen Layer: 开 | 关 | GND | 3V3 | M- | A | B | M+ | 靠 | 立 | 卖 | 不 | 发 | 钱 | 板 | 赚 | 创 | 程 | 以 | 养 | 师 | 工 | 中 | 任 | 国 | 为 | 己 | 培 | 立创天猛星开发板 | 简易PID入门项目
